# EAGLE design AudioMoth 1.1.0 (EAGLE 9.0.0)
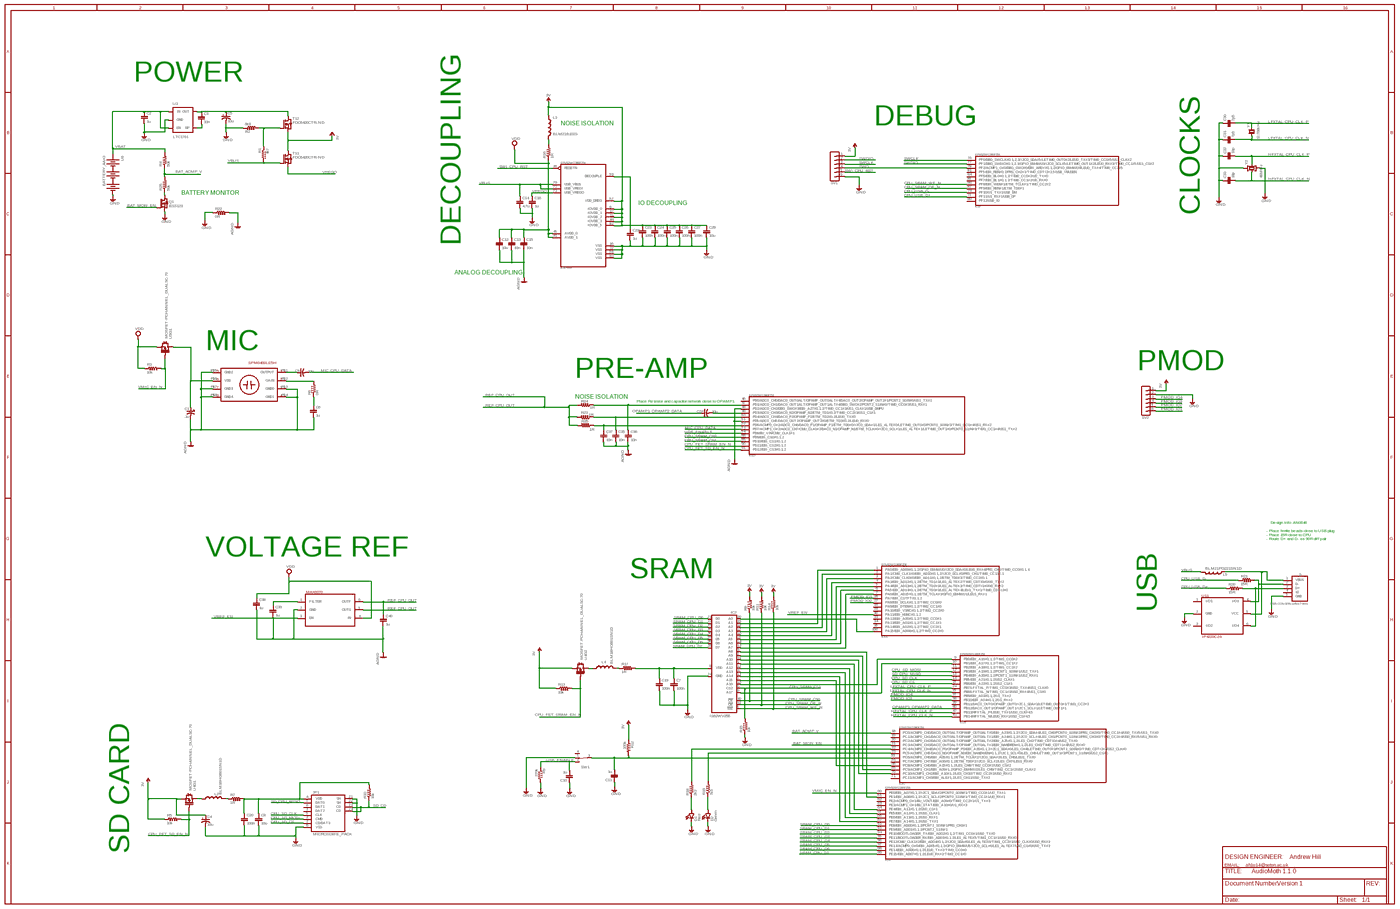
[diagram p0: schematic, sheet 1, overview]
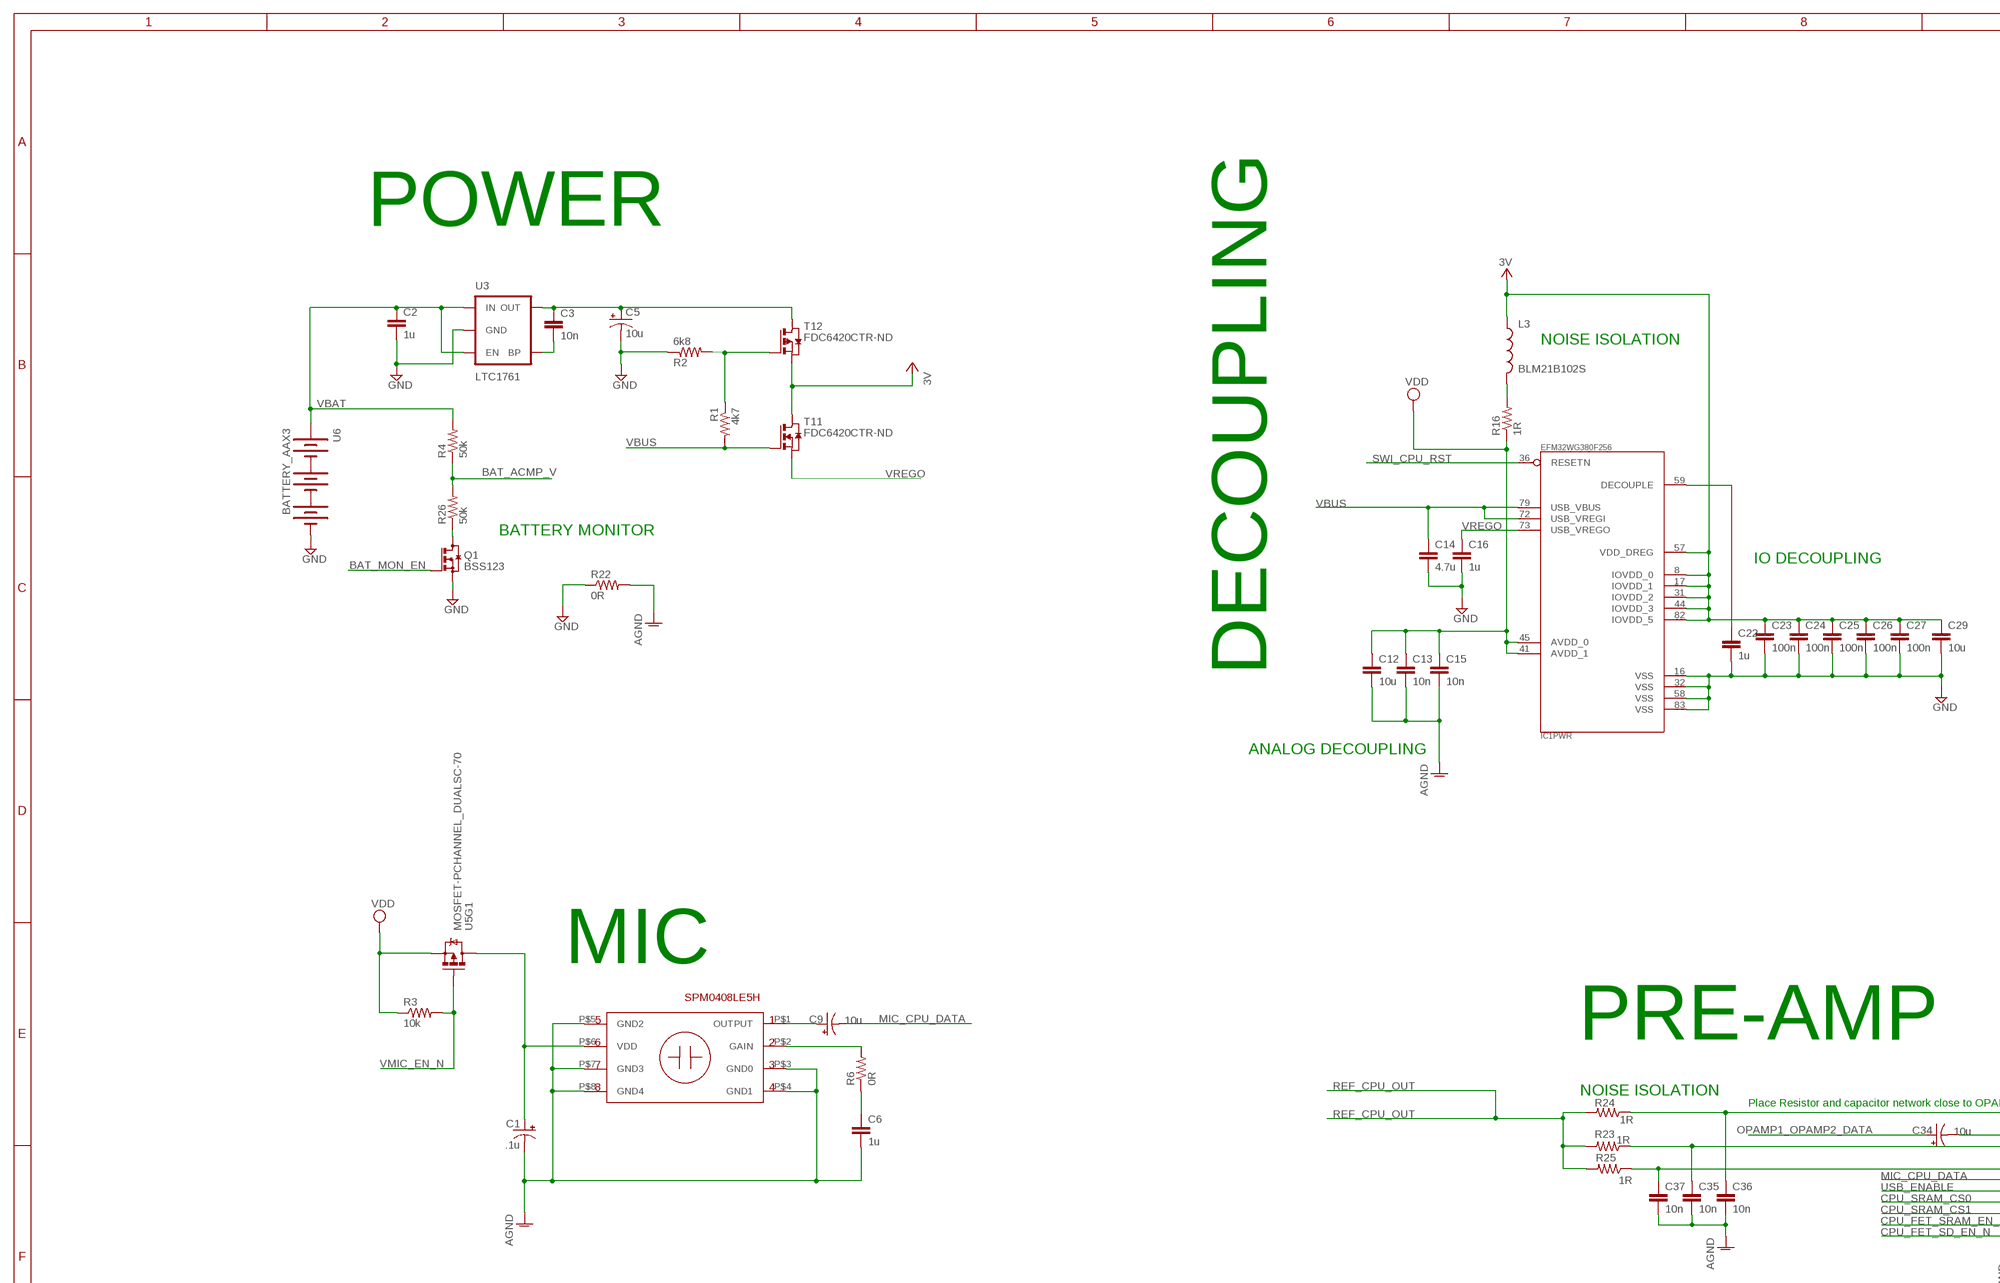
[diagram p1: schematic, sheet 1, part 1 of 4]
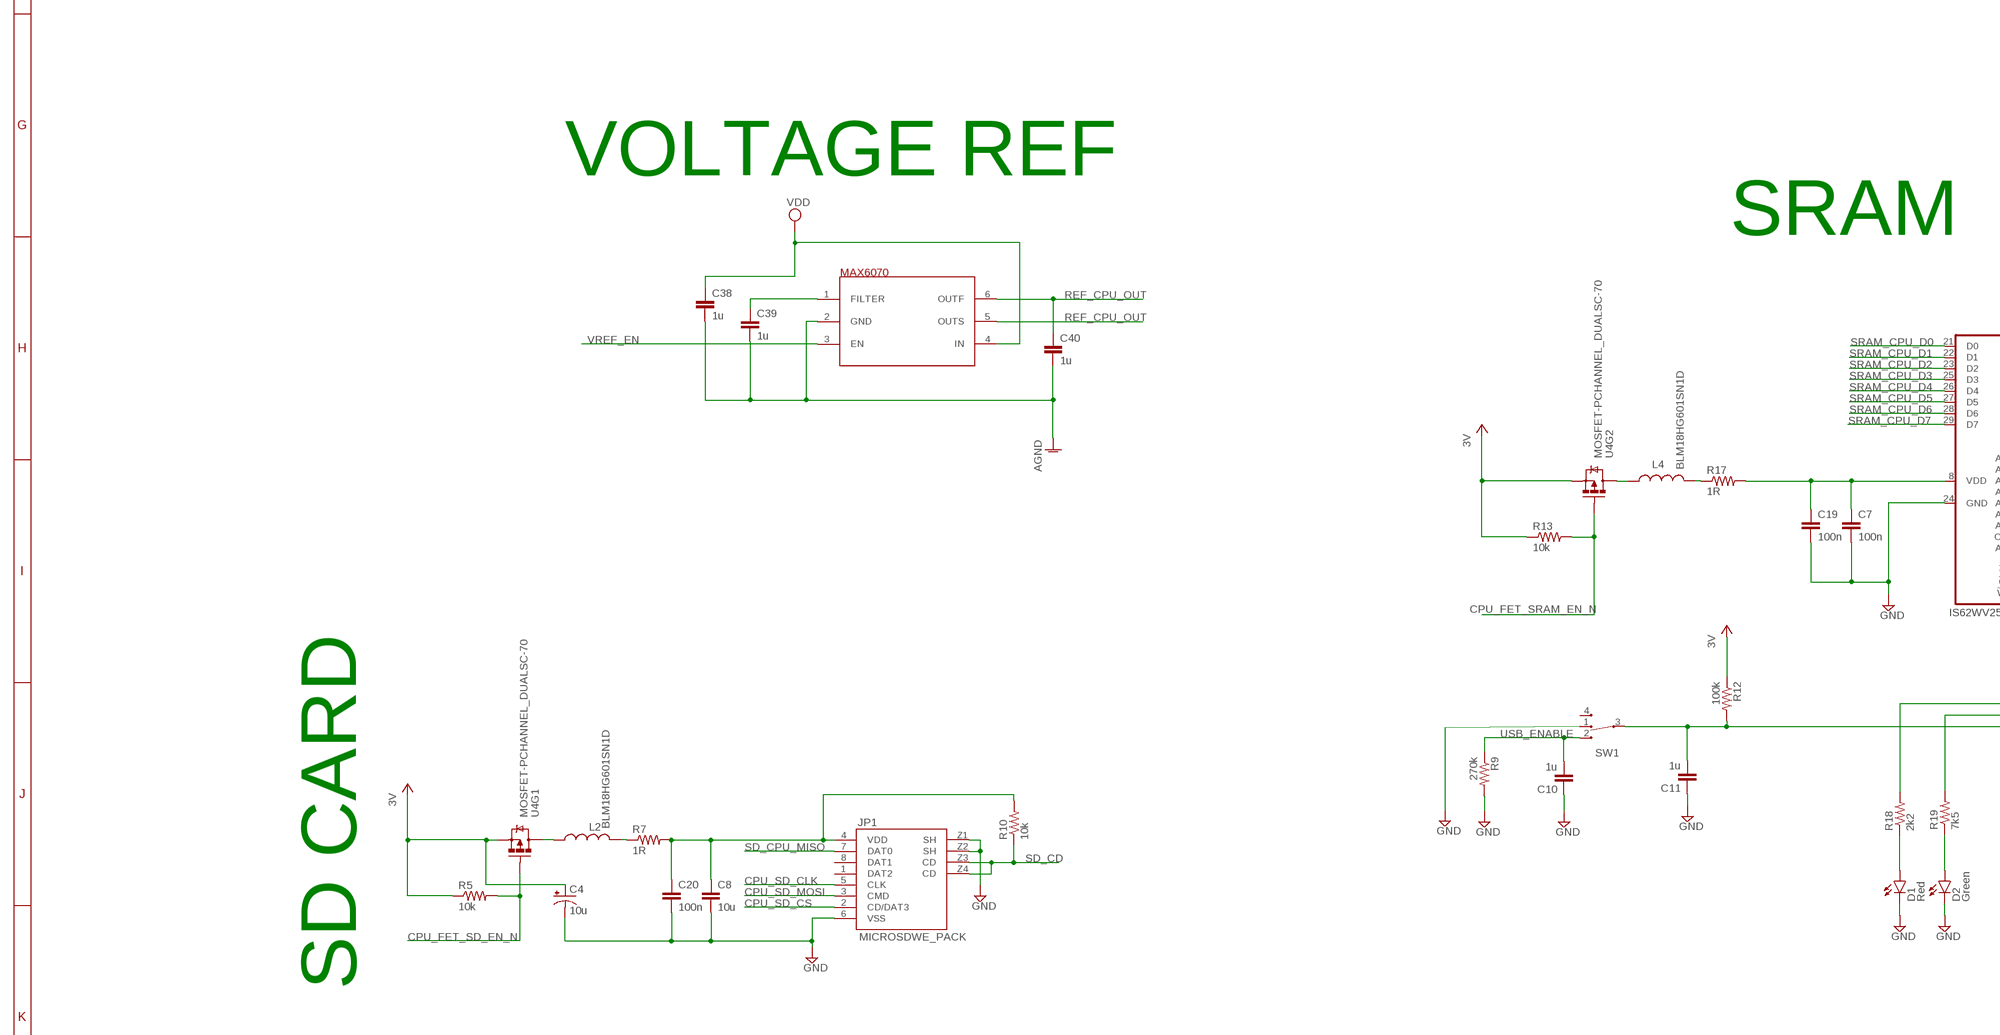
[diagram p2: schematic, sheet 1, part 2 of 4]
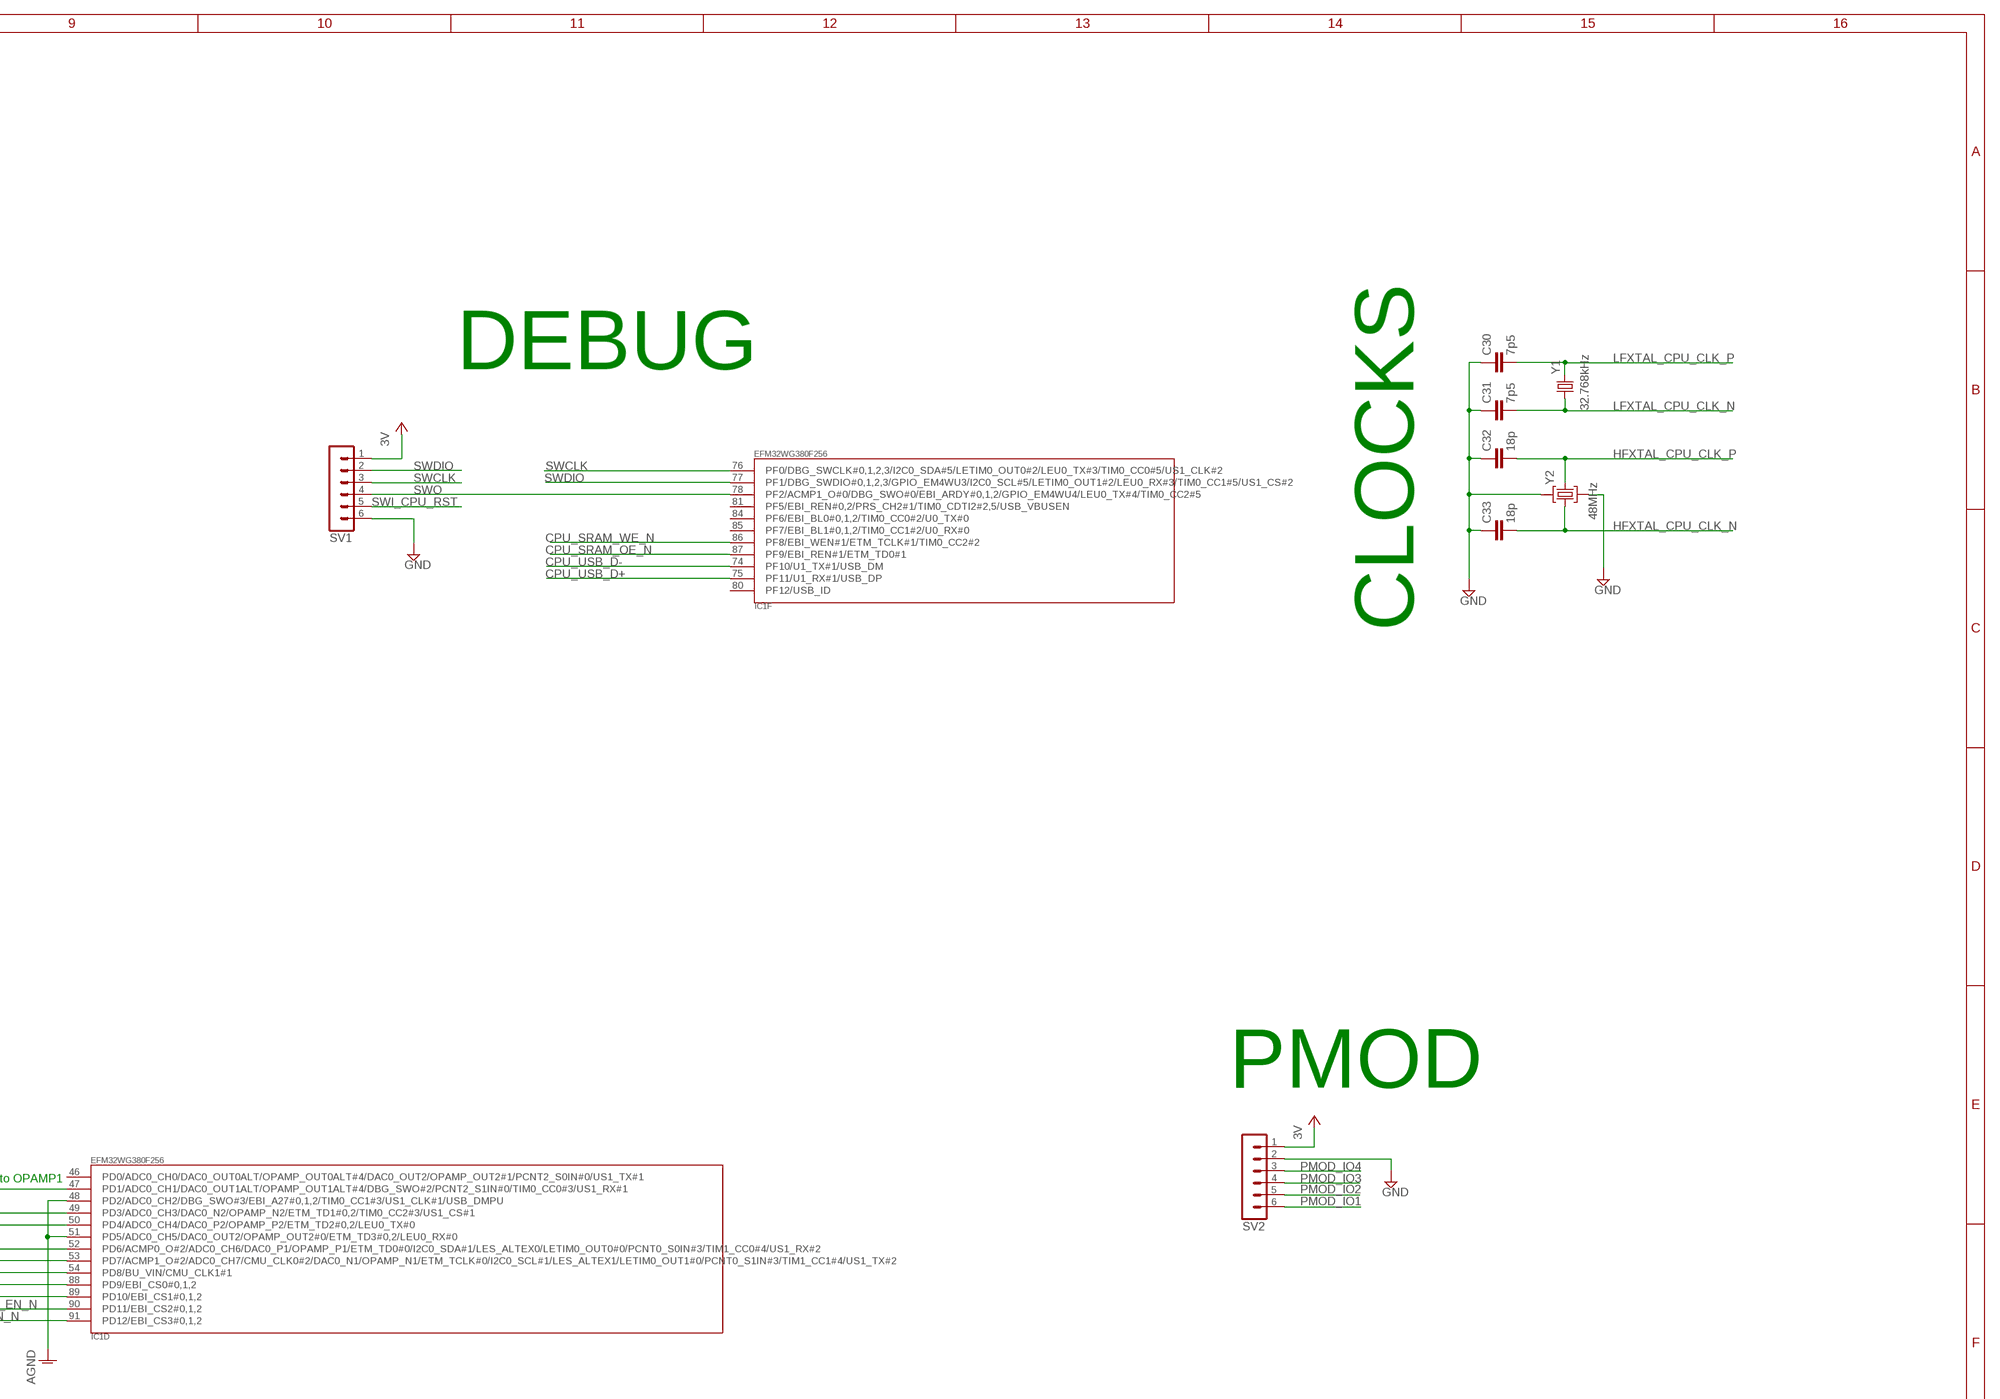
[diagram p3: schematic, sheet 1, part 3 of 4]
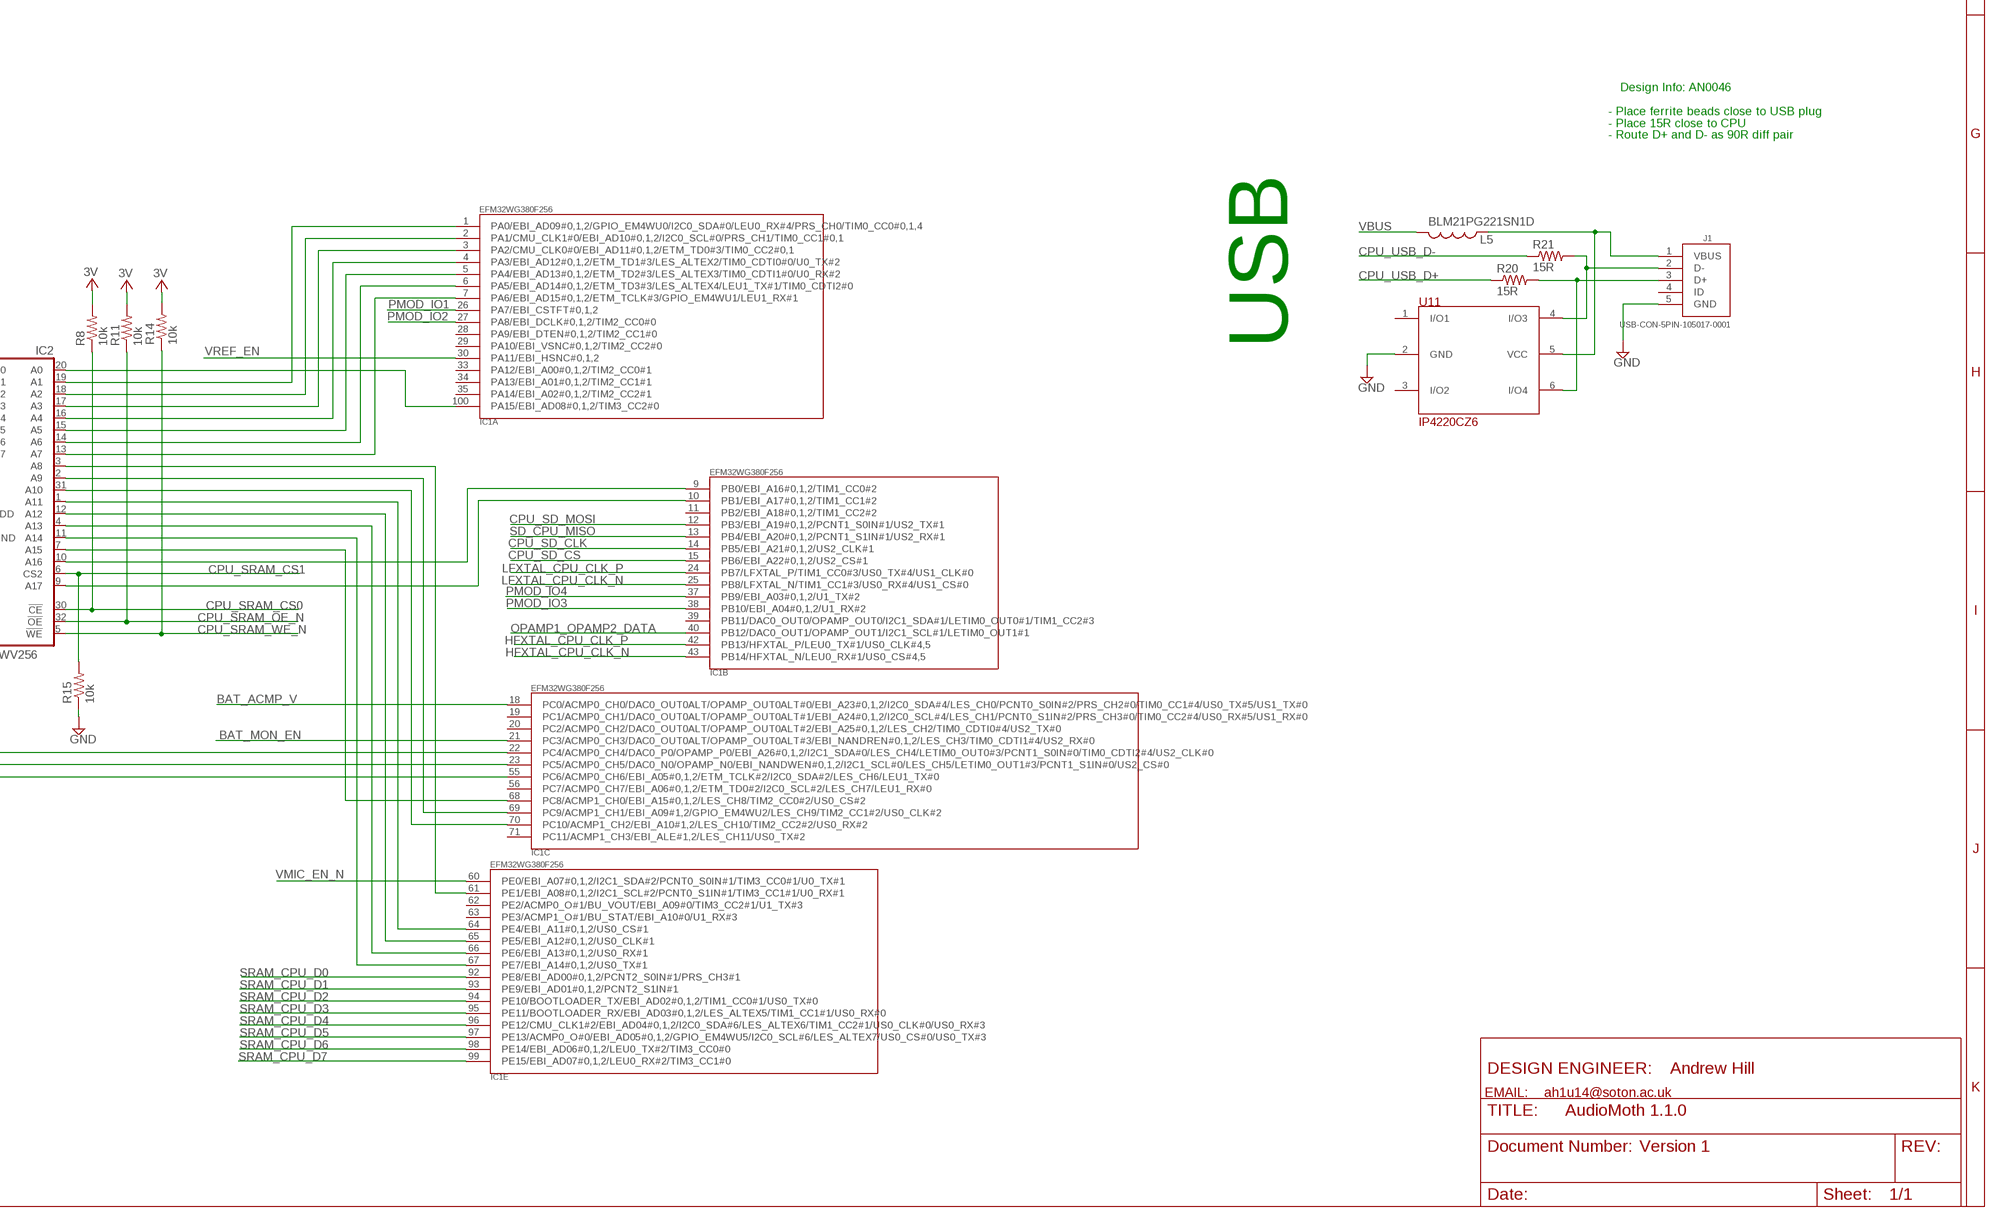
[diagram p4: schematic, sheet 1, part 4 of 4]

## Parts
C1  .1u  CAP_POL1206-KIT  [EIA3216-KIT]
C2  1u  CAP_0402  [0402]
C3  10n  CAP_0402  [0402]
C4  10u  CAP_POL1206-KIT  [EIA3216-KIT]
C5  10u  CAP_POL1206-KIT  [EIA3216-KIT]
C6  1u  CAP_0402  [0402]
C7  100n  CAP_0402  [0402]
C8  10u  C-EUC0603  [C0603]
C9  10u  CAP_POL1206-KIT  [EIA3216-KIT]
C10  1u  CAP_0402  [0402]
C11  1u  CAP_0402  [0402]
C12  10u  CAP0603-CAP  [0603-CAP]
C13  10n  CAP_0402  [0402]
C14  4.7u  CAP_0402  [0402]
C15  10n  CAP_0402  [0402]
C16  1u  CAP_0402  [0402]
C19  100n  CAP_0402  [0402]
C20  100n  CAP_0402  [0402]
C22  1u  CAP_0402  [0402]
C23  100n  CAP_0402  [0402]
C24  100n  CAP_0402  [0402]
C25  100n  CAP_0402  [0402]
C26  100n  CAP_0402  [0402]
C27  100n  CAP_0402  [0402]
C29  10u  C-EUC0603  [C0603]
C30  7p5  CAP_0402  [0402]
C31  7p5  CAP_0402  [0402]
C32  18p  CAP_0402  [0402]
C33  18p  CAP_0402  [0402]
C34  10u  CAP_POL1206-KIT  [EIA3216-KIT]
C35  10n  CAP_0402  [0402]
C36  10n  CAP_0402  [0402]
C37  10n  CAP_0402  [0402]
C38  1u  CAP_0402  [0402]
C39  1u  CAP_0402  [0402]
C40  1u  CAP_0402  [0402]
D1  Red  LED0603  [LED-0603]
D2  Green  LED0603  [LED-0603]
IC1  EFM32WG380F256  [QFP100]
IC2  IS62WV256  [IS62WV256]
J1  USB-CON-5PIN-105017-0001  [USB-MICRO-MOLEX-105017-0001]
JP1  MICROSDWE_PACK  [693071010811]
L2  BLM18HG601SN1D  INDUCTOR0603  [0603-RES]
L3  BLM21B102S  INDUCTOR0805  [0805]
L4  BLM18HG601SN1D  INDUCTOR0603  [0603-RES]
L5  BLM21PG221SN1D  INDUCTOR0603  [0603-RES]
Q1  BSS123  [SOT23]
R1  4k7  RES_0402  [0402]
R2  6k8  RES_0402  [0402]
R3  10k  RES_0402  [0402]
R4  50k  RES_0402  [0402]
R5  10k  RES_0402  [0402]
R6  0R  RES_0402  [0402]
R7  1R  RES_0402  [0402]
R8  10k  RES_0402  [0402]
R9  270k  RES_0402  [0402]
R10  10k  RES_0402  [0402]
R11  10k  RES_0402  [0402]
R12  100k  RES_0402  [0402]
R13  10k  RES_0402  [0402]
R14  10k  RES_0402  [0402]
R15  10k  RES_0402  [0402]
R16  1R  RES_0402  [0402]
R17  1R  RES_0402  [0402]
R18  2k2  RES_0402  [0402]
R19  7k5  RES_0402  [0402]
R20  15R  RES_0402  [0402]
R21  15R  RES_0402  [0402]
R22  0R  RESISTOR0603-RES  [0603-RES]
R23  1R  RES_0402  [0402]
R24  1R  RES_0402  [0402]
R25  1R  RES_0402  [0402]
R26  50k  RES_0402  [0402]
SV1  MA06-1SMD_BOARD_EDGE  [TSM-106-X-SH-BOARDEDGE]
SV2  MA06-1SMD_BOARD_EDGE  [TSM-106-X-SH-BOARDEDGE]
SW1  CT10-XXXX-CSS131  [CT10-XXXX-G4]
T1  FDC6420CTR-ND  PN_MOSFET-  [SOT23-6]
U1  MAX6070SOT23  [SOT26@1]
U2  SPM0408LE5H  [SPM0408LE5H-TB]
U3  LTC1761  [SOT23-5]
U4  MOSFET-PCHANNEL_DUALSC-70  [SC-70]
U5  MOSFET-PCHANNEL_DUALSC-70  [SC-70]
U6  BATTERY_AAX3  [BATTERY-AAX3]
U11  IP4220CZ6  [SC-74]
Y1  32.768kHz  CRYSTALEPSONMC146  [CRYSTAL-32KHZ-SMD_EPSON_MC146]
Y2  48MHz  XRCGB48M000F4M00R0  [XRCGB48M000F4M00R0]

## Nets
+3V3: C4.A(+) C23.1 C24.1 C25.1 C26.1 C27.1 C29.1 IC1.8(PWR:IOVDD_0) IC1.17(PWR:IOVDD_1) IC1.31(PWR:IOVDD_2) IC1.44(PWR:IOVDD_3) IC1.57(PWR:VDD_DREG) IC1.82(PWR:IOVDD_5) L3.1 R5.1 R8.2 R11.2 R12.1 R13.1 R14.2 SV1.1 SV2.1 T1.2(2:S) T1.6(1:D) U4.1(S) U4.4(S) ; supply symbol labelled 3V
AGND: C1.C(-) C6.2 C12.2 C13.2 C15.2 C35.2 C36.2 C37.2 C38.2 C39.2 C40.2 IC1.48(D:PD2/ADC0_CH2/DBG_SWO#3/EBI_A27#0,1,2/TIM0_CC1#3/US1_CLK#1/USB_DMPU) IC1.51(D:PD5/ADC0_CH5/DAC0_OUT2/OPAMP_OUT2#0/ETM_TD3#0,2/LEU0_RX#0) R22.2 U1.2(GND) U2.P$3(GND0) U2.P$4(GND1) U2.P$5(GND2) U2.P$7(GND3) U2.P$8(GND4)
BAT_ACMP_V: IC1.18(C:PC0/ACMP0_CH0/DAC0_OUT0ALT/OPAMP_OUT0ALT#0/EBI_A23#0,1,2/I2C0_SDA#4/LES_CH0/PCNT0_S0IN#2/PRS_CH2#0/TIM0_CC1#4/US0_TX#5/US1_TX#0) R4.1 R26.2
BAT_MON_EN: IC1.21(C:PC3/ACMP0_CH3/DAC0_OUT0ALT/OPAMP_OUT0ALT#3/EBI_NANDREN#0,1,2/LES_CH3/TIM0_CDTI1#4/US2_RX#0) Q1.1(G)
CPU_FET_SD_EN_N: IC1.91(D:PD12/EBI_CS3#0,1,2) R5.2 U4.2(G)
CPU_FET_SRAM_EN_N: IC1.90(D:PD11/EBI_CS2#0,1,2) R13.2 U4.5(G)
CPU_SD_CLK: IC1.14(B:PB5/EBI_A21#0,1,2/US2_CLK#1) JP1.5(CLK)
CPU_SD_CS: IC1.15(B:PB6/EBI_A22#0,1,2/US2_CS#1) JP1.2(CD/DAT3)
CPU_SD_MOSI: IC1.12(B:PB3/EBI_A19#0,1,2/PCNT1_S0IN#1/US2_TX#1) JP1.3(CMD)
CPU_SRAM_CS0: IC1.88(D:PD9/EBI_CS0#0,1,2) IC2.30(!CE) R8.1
CPU_SRAM_CS1: IC1.89(D:PD10/EBI_CS1#0,1,2) IC2.6(CS2) R15.2
CPU_SRAM_OE_N: IC1.87(F:PF9/EBI_REN#1/ETM_TD0#1) IC2.32(!OE) R11.1
CPU_SRAM_WE_N: IC1.86(F:PF8/EBI_WEN#1/ETM_TCLK#1/TIM0_CC2#2) IC2.5(!WE) R14.1
CPU_USB_D+: IC1.75(F:PF11/U1_RX#1/USB_DP) R20.1
CPU_USB_D-: IC1.74(F:PF10/U1_TX#1/USB_DM) R21.1
GND: C2.2 C4.C(-) C5.C(-) C7.2 C8.2 C10.1 C11.1 C14.2 C16.2 C19.2 C20.2 C22.2 C23.2 C24.2 C25.2 C26.2 C27.2 C29.2 C30.1 C31.1 C32.1 C33.1 D1.C D2.C IC1.16(PWR:VSS) IC1.32(PWR:VSS) IC1.58(PWR:VSS) IC1.83(PWR:VSS) IC2.24(GND) J1.5(GND) JP1.6(VSS) JP1.Z1(SH) JP1.Z2(SH) Q1.2(S) R2.1 R9.2 R15.1 R22.1 SV1.6 SV2.2 SW1.1 U3.2(GND) U6.GND@2(-) U11.2(GND) Y2.P$2 Y2.P$4
HFXTAL_CPU_CLK_N: C33.2 IC1.43(B:PB14/HFXTAL_N/LEU0_RX#1/US0_CS#4,5) Y2.P$3
HFXTAL_CPU_CLK_P: C32.2 IC1.42(B:PB13/HFXTAL_P/LEU0_TX#1/US0_CLK#4,5) Y2.P$1
LFXTAL_CPU_CLK_N: C31.2 IC1.25(B:PB8/LFXTAL_N/TIM1_CC1#3/US0_RX#4/US1_CS#0) Y1.P$2
LFXTAL_CPU_CLK_P: C30.2 IC1.24(B:PB7/LFXTAL_P/TIM1_CC0#3/US0_TX#4/US1_CLK#0) Y1.P$1
MIC_CPU_DATA: C9.C(-) IC1.53(D:PD7/ACMP1_O#2/ADC0_CH7/CMU_CLK0#2/DAC0_N1/OPAMP_N1/ETM_TCLK#0/I2C0_SCL#1/LES_ALTEX1/LETIM0_OUT1#0/PCNT0_S1IN#3/TIM1_CC1#4/US1_TX#2)
N$2: L3.2 R16.2
N$3: C22.1 IC1.59(PWR:DECOUPLE)
N$4: C8.1 C20.1 JP1.4(VDD) R7.2 R10.2
N$5: C34.C(-) IC1.49(D:PD3/ADC0_CH3/DAC0_N2/OPAMP_N2/ETM_TD1#0,2/TIM0_CC2#3/US1_CS#1)
N$6: L2.2 R7.1
N$7: L2.1 U4.6(D)
N$8: C9.A(+) U2.P$1(OUTPUT)
N$9: Q1.3(D) R26.1
N$11: C11.2 IC1.55(C:PC6/ACMP0_CH6/EBI_A05#0,1,2/ETM_TCLK#2/I2C0_SDA#2/LES_CH6/LEU1_TX#0) R12.2 SW1.3
N$13: C3.1 C5.A(+) T1.4(2:D) U3.5(OUT)
N$14: D2.A R19.1
N$15: D1.A R18.1
N$16: IC1.23(C:PC5/ACMP0_CH5/DAC0_N0/OPAMP_N0/EBI_NANDWEN#0,1,2/I2C1_SCL#0/LES_CH5/LETIM0_OUT1#3/PCNT1_S1IN#0/US2_CS#0) R19.2
N$17: IC1.22(C:PC4/ACMP0_CH4/DAC0_P0/OPAMP_P0/EBI_A26#0,1,2/I2C1_SDA#0/LES_CH4/LETIM0_OUT0#3/PCNT1_S0IN#0/TIM0_CDTI2#4/US2_CLK#0) R18.2
N$19: J1.1(VBUS) L5.1 U11.5(VCC)
N$23: C3.2 U3.4(BP)
N$28: IC1.100(A:PA15/EBI_AD08#0,1,2/TIM3_CC2#0) IC2.20(A0)
N$30: IC1.1(A:PA0/EBI_AD09#0,1,2/GPIO_EM4WU0/I2C0_SDA#0/LEU0_RX#4/PRS_CH0/TIM0_CC0#0,1,4) IC2.19(A1)
N$31: J1.2(D-) R21.2 U11.4(I/O3)
N$32: IC1.2(A:PA1/CMU_CLK1#0/EBI_AD10#0,1,2/I2C0_SCL#0/PRS_CH1/TIM0_CC1#0,1) IC2.18(A2)
N$33: IC1.3(A:PA2/CMU_CLK0#0/EBI_AD11#0,1,2/ETM_TD0#3/TIM0_CC2#0,1) IC2.17(A3)
N$34: J1.3(D+) R20.2 U11.6(I/O4)
N$35: R6.2 U2.P$2(GAIN)
N$36: C6.1 R6.1
N$37: IC1.4(A:PA3/EBI_AD12#0,1,2/ETM_TD1#3/LES_ALTEX2/TIM0_CDTI0#0/U0_TX#2) IC2.16(A4)
N$38: IC1.5(A:PA4/EBI_AD13#0,1,2/ETM_TD2#3/LES_ALTEX3/TIM0_CDTI1#0/U0_RX#2) IC2.15(A5)
N$39: IC1.6(A:PA5/EBI_AD14#0,1,2/ETM_TD3#3/LES_ALTEX4/LEU1_TX#1/TIM0_CDTI2#0) IC2.14(A6)
N$40: IC1.7(A:PA6/EBI_AD15#0,1,2/ETM_TCLK#3/GPIO_EM4WU1/LEU1_RX#1) IC2.13(A7)
N$41: IC1.61(E:PE1/EBI_A08#0,1,2/I2C1_SCL#2/PCNT0_S1IN#1/TIM3_CC1#1/U0_RX#1) IC2.3(A8)
N$42: IC1.69(C:PC9/ACMP1_CH1/EBI_A09#1,2/GPIO_EM4WU2/LES_CH9/TIM2_CC1#2/US0_CLK#2) IC2.2(A9)
N$43: IC1.70(C:PC10/ACMP1_CH2/EBI_A10#1,2/LES_CH10/TIM2_CC2#2/US0_RX#2) IC2.31(A10)
N$44: L4.1 U4.3(D)
N$45: IC1.64(E:PE4/EBI_A11#0,1,2/US0_CS#1) IC2.1(A11)
N$46: IC1.65(E:PE5/EBI_A12#0,1,2/US0_CLK#1) IC2.12(A12)
N$47: IC1.66(E:PE6/EBI_A13#0,1,2/US0_RX#1) IC2.4(A13)
N$48: IC1.67(E:PE7/EBI_A14#0,1,2/US0_TX#1) IC2.11(A14)
N$49: IC1.68(C:PC8/ACMP1_CH0/EBI_A15#0,1,2/LES_CH8/TIM2_CC0#2/US0_CS#2) IC2.7(A15)
N$50: IC1.9(B:PB0/EBI_A16#0,1,2/TIM1_CC0#2) IC2.10(A16)
N$52: IC1.10(B:PB1/EBI_A17#0,1,2/TIM1_CC1#2) IC2.9(A17)
N$53: C35.1 IC1.50(D:PD4/ADC0_CH4/DAC0_P2/OPAMP_P2/ETM_TD2#0,2/LEU0_TX#0) R23.1
N$54: C7.1 C19.1 IC2.8(VDD) R17.2
N$55: C36.1 IC1.47(D:PD1/ADC0_CH1/DAC0_OUT1ALT/OPAMP_OUT1ALT#4/DBG_SWO#2/PCNT2_S1IN#0/TIM0_CC0#3/US1_RX#1) R24.1
N$56: L4.2 R17.1
N$57: C37.1 IC1.52(D:PD6/ACMP0_O#2/ADC0_CH6/DAC0_P1/OPAMP_P1/ETM_TD0#0/I2C0_SDA#1/LES_ALTEX0/LETIM0_OUT0#0/PCNT0_S0IN#3/TIM1_CC0#4/US1_RX#2) R25.1
N$59: C39.1 U1.1(FILTER)
N$62: R1.1 R2.2 T1.3(2:G)
OPAMP1_OPAMP2_DATA: C34.A(+) IC1.40(B:PB12/DAC0_OUT1/OPAMP_OUT1/I2C1_SCL#1/LETIM0_OUT1#1)
PMOD_IO1: IC1.26(A:PA7/EBI_CSTFT#0,1,2) SV2.6
PMOD_IO2: IC1.27(A:PA8/EBI_DCLK#0,1,2/TIM2_CC0#0) SV2.5
PMOD_IO3: IC1.38(B:PB10/EBI_A04#0,1,2/U1_RX#2) SV2.4
PMOD_IO4: IC1.37(B:PB9/EBI_A03#0,1,2/U1_TX#2) SV2.3
REF_CPU_OUT: C40.1 R23.2 R24.2 R25.2 U1.5(OUTS) U1.6(OUTF)
SD_CD: JP1.Z3(CD) JP1.Z4(CD) R10.1
SD_CPU_MISO: IC1.13(B:PB4/EBI_A20#0,1,2/PCNT1_S1IN#1/US2_RX#1) JP1.7(DAT0)
SRAM_CPU_D0: IC1.92(E:PE8/EBI_AD00#0,1,2/PCNT2_S0IN#1/PRS_CH3#1) IC2.21(D0)
SRAM_CPU_D1: IC1.93(E:PE9/EBI_AD01#0,1,2/PCNT2_S1IN#1) IC2.22(D1)
SRAM_CPU_D2: IC1.94(E:PE10/BOOTLOADER_TX/EBI_AD02#0,1,2/TIM1_CC0#1/US0_TX#0) IC2.23(D2)
SRAM_CPU_D3: IC1.95(E:PE11/BOOTLOADER_RX/EBI_AD03#0,1,2/LES_ALTEX5/TIM1_CC1#1/US0_RX#0) IC2.25(D3)
SRAM_CPU_D4: IC1.96(E:PE12/CMU_CLK1#2/EBI_AD04#0,1,2/I2C0_SDA#6/LES_ALTEX6/TIM1_CC2#1/US0_CLK#0/US0_RX#3) IC2.26(D4)
SRAM_CPU_D5: IC1.97(E:PE13/ACMP0_O#0/EBI_AD05#0,1,2/GPIO_EM4WU5/I2C0_SCL#6/LES_ALTEX7/US0_CS#0/US0_TX#3) IC2.27(D5)
SRAM_CPU_D6: IC1.98(E:PE14/EBI_AD06#0,1,2/LEU0_TX#2/TIM3_CC0#0) IC2.28(D6)
SRAM_CPU_D7: IC1.99(E:PE15/EBI_AD07#0,1,2/LEU0_RX#2/TIM3_CC1#0) IC2.29(D7)
SWCLK: IC1.76(F:PF0/DBG_SWCLK#0,1,2,3/I2C0_SDA#5/LETIM0_OUT0#2/LEU0_TX#3/TIM0_CC0#5/US1_CLK#2) SV1.3
SWDIO: IC1.77(F:PF1/DBG_SWDIO#0,1,2,3/GPIO_EM4WU3/I2C0_SCL#5/LETIM0_OUT1#2/LEU0_RX#3/TIM0_CC1#5/US1_CS#2) SV1.2
SWI_CPU_RST: IC1.36(PWR:RESETN) SV1.5
SWO: IC1.78(F:PF2/ACMP1_O#0/DBG_SWO#0/EBI_ARDY#0,1,2/GPIO_EM4WU4/LEU0_TX#4/TIM0_CC2#5) SV1.4
USB_ENABLE: C10.2 IC1.54(D:PD8/BU_VIN/CMU_CLK1#1) R9.1 SW1.2
VAMP: C1.A(+) U2.P$6(VDD) U5.6(D)
VBAT: C2.1 R4.2 U3.1(IN) U3.3(EN) U6.PWR@1(+)
VBUS: C14.1 IC1.72(PWR:USB_VREGI) IC1.79(PWR:USB_VBUS) L5.2 R1.2 T1.1(1:G)
VDD: C12.1 C13.1 C15.1 C38.1 IC1.41(PWR:AVDD_1) IC1.45(PWR:AVDD_0) R3.1 R16.1 U1.4(IN) U5.1(S)
VMIC_EN_N: IC1.60(E:PE0/EBI_A07#0,1,2/I2C1_SDA#2/PCNT0_S0IN#1/TIM3_CC0#1/U0_TX#1) R3.2 U5.2(G)
VREF_EN: IC1.30(A:PA11/EBI_HSNC#0,1,2) U1.3(EN)
VREGO: C16.1 IC1.73(PWR:USB_VREGO) T1.5(1:S)
Unconnected: IC1.11(B:PB2/EBI_A18#0,1,2/TIM1_CC2#2) IC1.19(C:PC1/ACMP0_CH1/DAC0_OUT0ALT/OPAMP_OUT0ALT#1/EBI_A24#0,1,2/I2C0_SCL#4/LES_CH1/PCNT0_S1IN#2/PRS_CH3#0/TIM0_CC2#4/US0_RX#5/US1_RX#0) IC1.20(C:PC2/ACMP0_CH2/DAC0_OUT0ALT/OPAMP_OUT0ALT#2/EBI_A25#0,1,2/LES_CH2/TIM0_CDTI0#4/US2_TX#0) IC1.28(A:PA9/EBI_DTEN#0,1,2/TIM2_CC1#0) IC1.29(A:PA10/EBI_VSNC#0,1,2/TIM2_CC2#0) IC1.33(A:PA12/EBI_A00#0,1,2/TIM2_CC0#1) IC1.34(A:PA13/EBI_A01#0,1,2/TIM2_CC1#1) IC1.35(A:PA14/EBI_A02#0,1,2/TIM2_CC2#1) IC1.39(B:PB11/DAC0_OUT0/OPAMP_OUT0/I2C1_SDA#1/LETIM0_OUT0#1/TIM1_CC2#3) IC1.46(D:PD0/ADC0_CH0/DAC0_OUT0ALT/OPAMP_OUT0ALT#4/DAC0_OUT2/OPAMP_OUT2#1/PCNT2_S0IN#0/US1_TX#1) IC1.56(C:PC7/ACMP0_CH7/EBI_A06#0,1,2/ETM_TD0#2/I2C0_SCL#2/LES_CH7/LEU1_RX#0) IC1.62(E:PE2/ACMP0_O#1/BU_VOUT/EBI_A09#0/TIM3_CC2#1/U1_TX#3) IC1.63(E:PE3/ACMP1_O#1/BU_STAT/EBI_A10#0/U1_RX#3) IC1.71(C:PC11/ACMP1_CH3/EBI_ALE#1,2/LES_CH11/US0_TX#2) IC1.80(F:PF12/USB_ID) IC1.81(F:PF5/EBI_REN#0,2/PRS_CH2#1/TIM0_CDTI2#2,5/USB_VBUSEN) IC1.84(F:PF6/EBI_BL0#0,1,2/TIM0_CC0#2/U0_TX#0) IC1.85(F:PF7/EBI_BL1#0,1,2/TIM0_CC1#2/U0_RX#0) J1.4(ID) JP1.1(DAT2) JP1.8(DAT1) SW1.4 U5.3(D) U5.4(S) U5.5(G) U11.1(I/O1) U11.3(I/O2)

## Notes on the sheet
- POWER
- NOISE ISOLATION | DEBUG
- BATTERY MONITOR
- IO DECOUPLING
- CLOCKS
- DECOUPLING
- ANALOG DECOUPLING
- MIC
- SPM0408LE5H
- PRE-AMP | PMOD
- NOISE ISOLATION
- Place Resistor and capacitor network close to OPAMP1
- Design Info: AN0046
- - Place ferrite beads close to USB plug
- - Place 15R close to CPU
- - Route D+ and D- as 90R diff pair
- VOLTAGE REF
- SRAM
- USB
- IS62WV256
- SD CARD
- DESIGN ENGINEER:    Andrew Hill
- EMAIL:    ah1u14@soton.ac.uk
- Version 1

## Library data of the parts
C1 = SparkFun-Passives:CAP_POL: Capacitor Polarized These are standard SMD and PTH capacitors. Normally 10uF, 47uF, and 100uF in electrolytic and tantalum varieties. Always verify the external diameter of the through hole cap, it varies with capacity, voltage, and manufacturer. The EIA devices should be standard.; MF: VISHAY SPRAGUE; MPN: 293D106X96R3A2TE3; OC_FARNELL: 1754143
C2 C3 C6 C7 C10 C11 C13-C16 C19 C20 C22-C27 C30-C33 = Perfect_0402:CAP_0402: 0402 (1005 Metric) Nick Garner - TeleSense
C4 C5 C9 C34 = SparkFun-Passives:CAP_POL: Capacitor Polarized These are standard SMD and PTH capacitors. Normally 10uF, 47uF, and 100uF in electrolytic and tantalum varieties. Always verify the external diameter of the through hole cap, it varies with capacity, voltage, and manufacturer. The EIA devices should be standard.; MF: AVX; MPN: 0603ZD106MAT2A; OC_FARNELL: 1867954
C8 C29 = rcl:C-EU: CAPACITOR, European symbol; MF: AVX; MPN: 0603ZD106MAT2A; OC_FARNELL: 1867954
C12 = SparkFun-Capacitors:CAP: Capacitor Standard 0603 ceramic capacitor, and 0.1" leaded capacitor.; MF: AVX; MPN: 0603ZD106MAT2A; OC_FARNELL: 1867954
C35-C37 = Perfect_0402:CAP_0402: 0402 (1005 Metric) Nick Garner - TeleSense; MF: WALSIN; MPN: 0603B103K250CT; OC_FARNELL: 2496827
C38-C40 = Perfect_0402:CAP_0402: 0402 (1005 Metric) Nick Garner - TeleSense; MF: MULTICOMP; MPN: MC0603F105Z100CT; OC_FARNELL: 1759398
D1 D2 = SparkFun-LED:LED: LEDs Standard schematic elements and footprints for 5mm, 3mm, 1206, and 0603 sized LEDs. 5mm - Spark Fun Electronics SKU : COM-00529 (and others)
IC1 = EFM32:EFM32WG380F256: EFM32WG380F256 Wonder Microcontroller in 14mm x 14mm QFP100 package
IC2 = acousticLib:IS62WV256
J1 = GeekAmmo:USB-CON-5PIN: Molex Micro USB 105017-0001
JP1 = acousticLib:MICROSD; MF: WURTH ELEKTRONIK; MPN: 693071010811; OC_FARNELL: 2081363
L2 L4 L5 = acousticLib:INDUCTOR: Inductors; OC_FARNELL: unknown
L3 = SparkFun-Passives:INDUCTOR: Inductors
Q1 = transistor-small-signal:BSS123: N-CHANNEL MOS FET
R1-R21 R26 = Perfect_0402:RES_0402: 0402 (1005 Metric) Nick Garner - TeleSense
R22 = SparkFun-Passives:RESISTOR: Resistor Basic schematic elements and footprints for 0603, 1206, and PTH resistors.
R23-R25 = Perfect_0402:RES_0402: 0402 (1005 Metric) Nick Garner - TeleSense; MF: MULTICOMP; MPN: MC0063W0603510K; OC_FARNELL: 9331700
SV1 SV2 = acousticLib:MA06-1: PIN HEADER; OC_FARNELL: unknown
SW1 = switch-coto:CT10-XXXX-: CT10 Series Molded Switch Source: www.cotorelay.com .. Coto_Technology__CT10-1530-G1.pdf
T1 = zetex:PN_MOSFET-: DUAL N AND P-CHANNEL ENHANCEMENT MODE MOSFET Source: Data sheet <http://www.farnell.com/datasheets/1693880.pdf>
U1 = acousticLib:MAX6070
U2 = acousticLib:SPM0408LE5H
U3 = acousticLib:LTC1761; MF: LINEAR TECHNOLOGY; MPN: LT1761ES5-3.3#TRMPBF; OC_FARNELL: 1663779
U4 U5 = acousticLib:MOSFET-PCHANNEL_DUAL
U6 = acousticLib:BATTERY_AAX3
U11 = acousticLib:IP4220CZ6: IP4220CZ6 The IP4220CZ6 is designed to protect I/O lines sensitive to capacitive load, such as USB 2.0 http://www.farnell.com/datasheets/1708221.pdf
Y1 = acousticLib:CRYSTAL: Various standard crystals. Proven footprints.; MF: AEL CRYSTALS; MPN: X32K768S019; OC_FARNELL: 2467443
Y2 = acousticLib:XRCGB48M000F4M00R0: XRCGB48M000F4M00R0 48MHz Clock; MF: ABRACON; MPN: ABM3B-12.000MHZ-B2-T; OC_FARNELL: 1611810

## Net classes
0 default: width 0.152 mm, drill 0.305 mm, clearance 0.152 mm

## Board
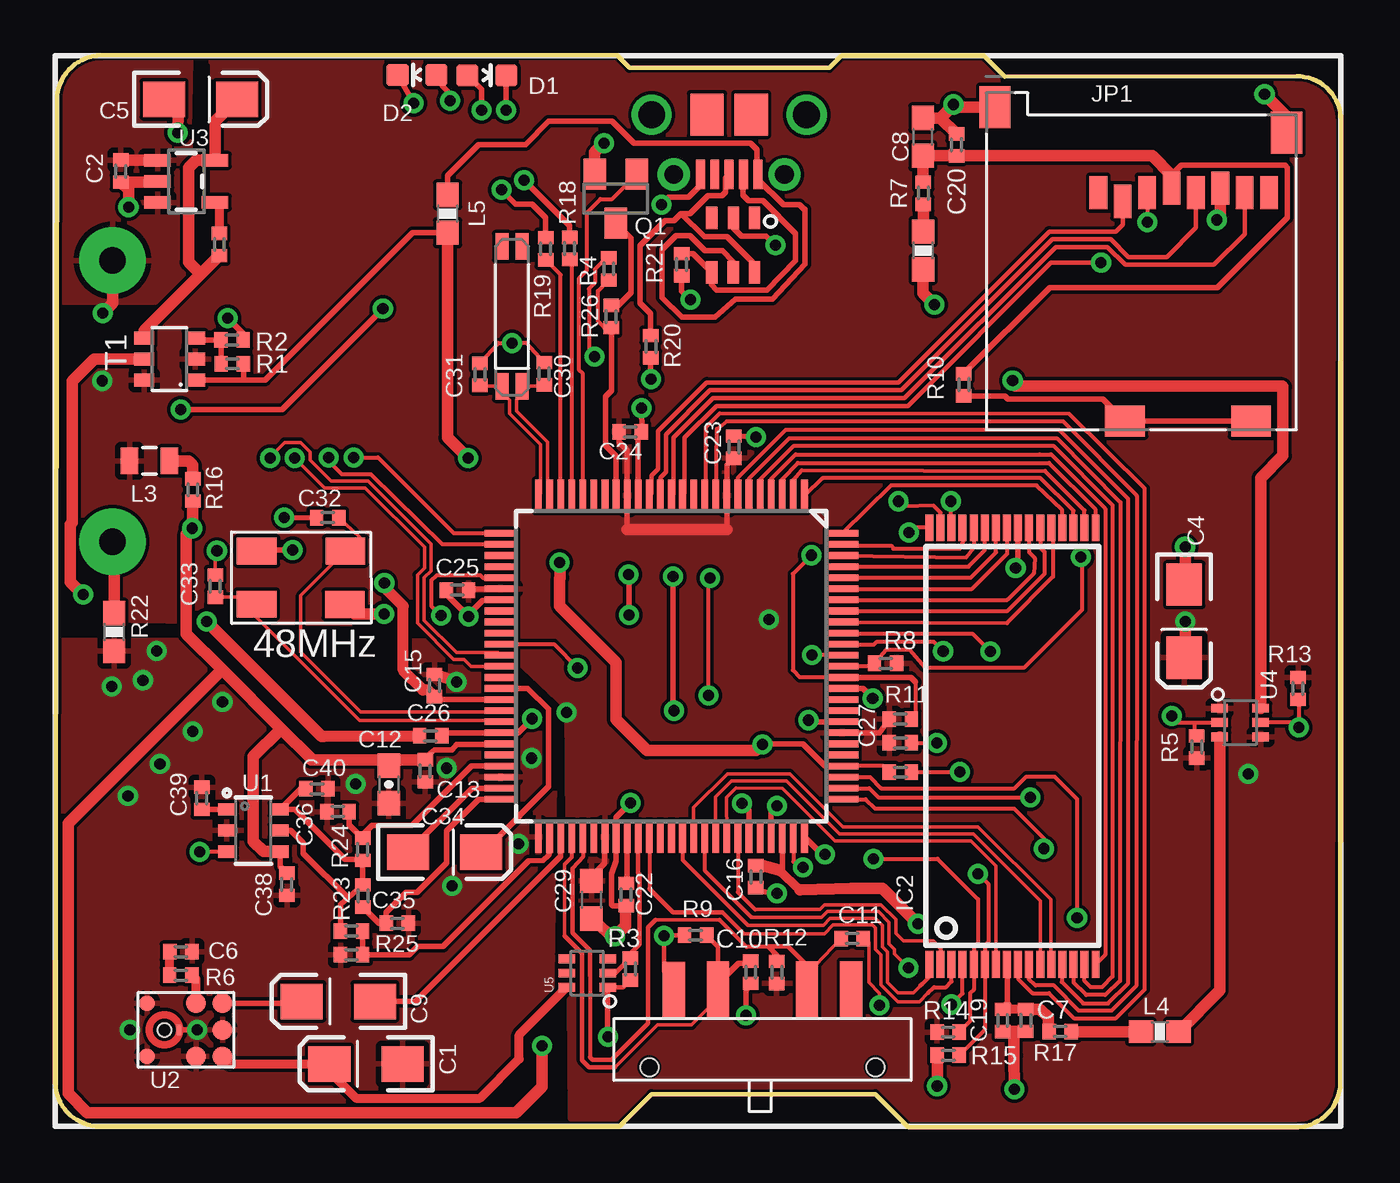
[diagram p5: board, top side]
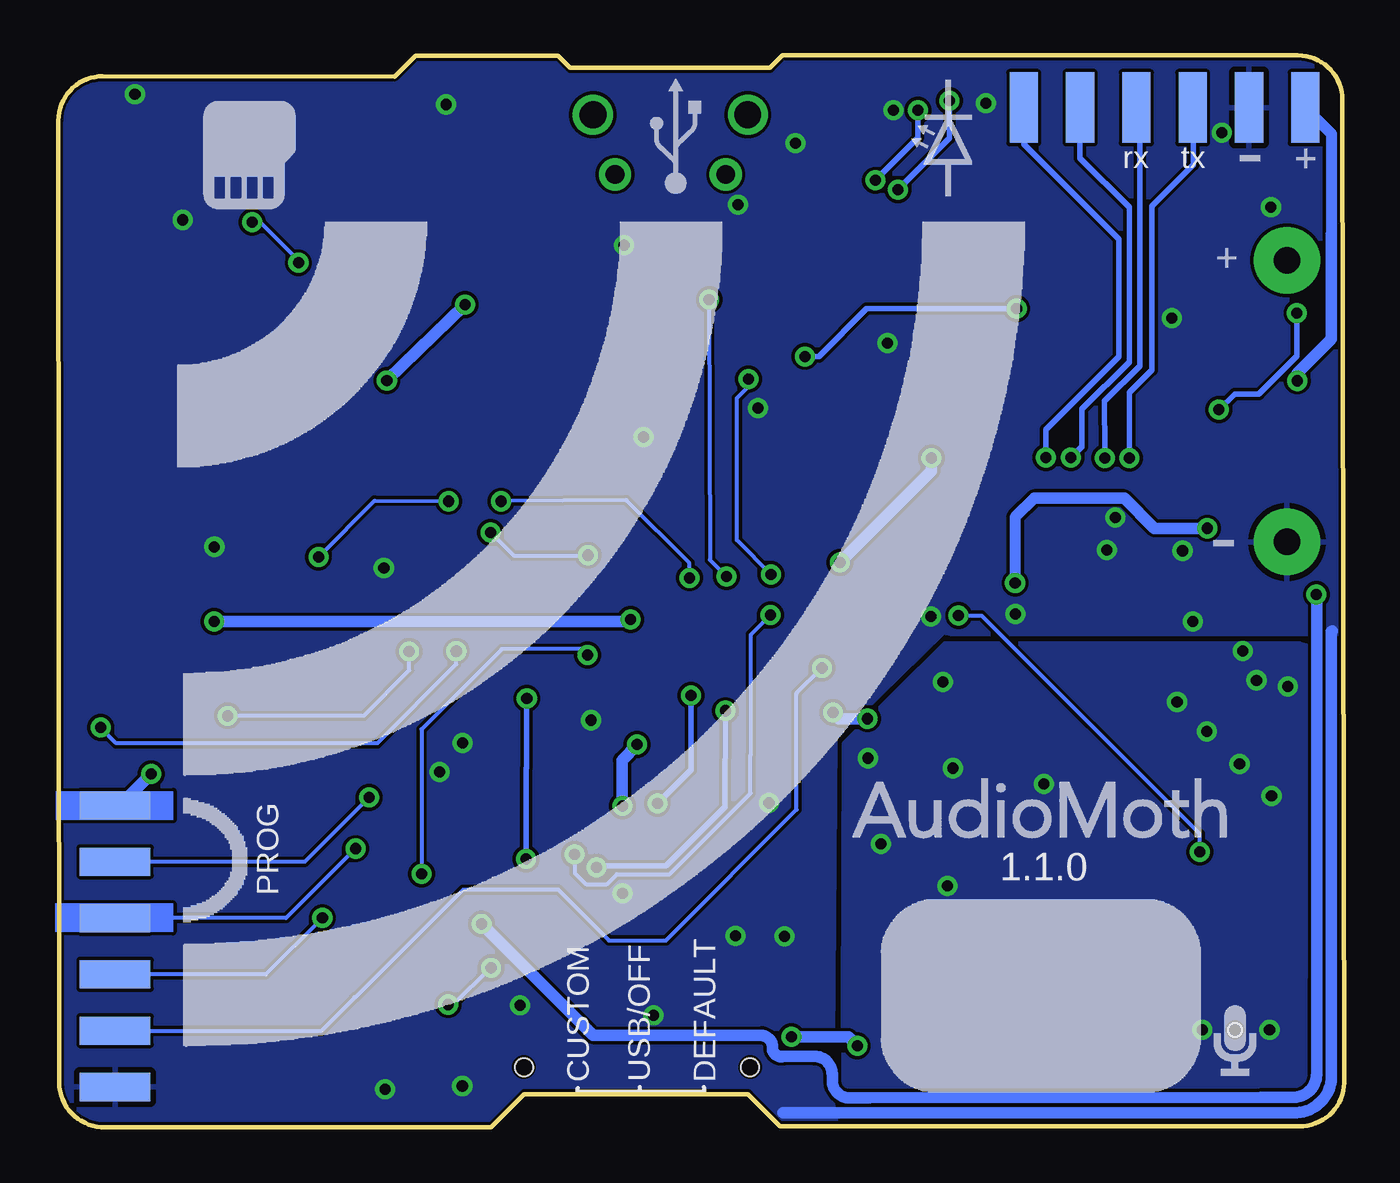
[diagram p6: board, bottom side, seen from below]

Size 58 x 48.36 mm. Coordinates in mm from the lower left corner, seen from the top.
Outline: 26.89,1.5 36.99,1.5 38.49,0 55.89,0 arc90 57.97,2 58,45.42 arc90 56,47.42 42.84,47.4 41.89,48.35 35.47,48.35 34.92,47.8 25.9,47.8 25.34,48.36 2.08,48.36 arc90 0.08,46.36 0,2 arc90 2.02,0.05 25.44,0.05 26.89,1.5
Copper layers (1*16): Top 0.035mm / dielectric 1.5mm / Bottom 0.035mm
Design rules "default *": minimum track width 5mil, minimum drill 0.019mm, track to track 6mil, track to pad 5mil, pad to pad 5mil, via to via 5mil, smd to smd 5mil, copper to edge 5mil, drill to drill 3mil, minimum pad ring 10mil, minimum via ring 8mil, stop-mask expansion 0mil, vias tented up to drill 20mil, thermal gap 10mil

### Footprints (pad centres in the part's own frame; a part is rotated, then mirrored left to right if it is on the bottom)
EIA3216-KIT = smd 1.9 x 1.6: A 1.65,0; C -1.65,0
0402 = smd 0.6 x 0.7: 1 -0.5,0; 2 0.5,0
C0603 = smd 1.1 x 1: 1 -0.85,0; 2 0.85,0
0603-CAP = smd 1.1 x 1: 1 -0.85,0; 2 0.85,0
LED-0603 = smd 1 x 1: A 0,-0.877; C 0,0.877
QFP100 = smd 1.45 x 0.3: 1 -7.7,6; 2 -7.7,5.5; 3 -7.7,5; 4 -7.7,4.5; 5 -7.7,4; 6 -7.7,3.5; 7 -7.7,3; 8 -7.7,2.5; 9 -7.7,2; 10 -7.7,1.5; 11 -7.7,1; 12 -7.7,0.5; 13 -7.7,0; 14 -7.7,-0.5; 15 -7.7,-1; 16 -7.7,-1.5; 17 -7.7,-2; 18 -7.7,-2.5; 19 -7.7,-3; 20 -7.7,-3.5; 21 -7.7,-4; 22 -7.7,-4.5; 23 -7.7,-5; 24 -7.7,-5.5; 25 -7.7,-6; 51 7.7,-6; 52 7.7,-5.5; 53 7.7,-5; 54 7.7,-4.5; 55 7.7,-4; 56 7.7,-3.5; 57 7.7,-3; 58 7.7,-2.5; 59 7.7,-2; 60 7.7,-1.5; 61 7.7,-1; 62 7.7,-0.5; 63 7.7,0; 64 7.7,0.5; 65 7.7,1; 66 7.7,1.5; 67 7.7,2; 68 7.7,2.5; 69 7.7,3; 70 7.7,3.5; 71 7.7,4; 72 7.7,4.5; 73 7.7,5; 74 7.7,5.5; 75 7.7,6 | smd 0.3 x 1.45: 26 -6,-7.7; 27 -5.5,-7.7; 28 -5,-7.7; 29 -4.5,-7.7; 30 -4,-7.7; 31 -3.5,-7.7; 32 -3,-7.7; 33 -2.5,-7.7; 34 -2,-7.7; 35 -1.5,-7.7; 36 -1,-7.7; 37 -0.5,-7.7; 38 0,-7.7; 39 0.5,-7.7; 40 1,-7.7; 41 1.5,-7.7; 42 2,-7.7; 43 2.5,-7.7; 44 3,-7.7; 45 3.5,-7.7; 46 4,-7.7; 47 4.5,-7.7; 48 5,-7.7; 49 5.5,-7.7; 50 6,-7.7; 76 6,7.7; 77 5.5,7.7; 78 5,7.7; 79 4.5,7.7; 80 4,7.7; 81 3.5,7.7; 82 3,7.7; 83 2.5,7.7; 84 2,7.7; 85 1.5,7.7; 86 1,7.7; 87 0.5,7.7; 88 0,7.7; 89 -0.5,7.7; 90 -1,7.7; 91 -1.5,7.7; 92 -2,7.7; 93 -2.5,7.7; 94 -3,7.7; 95 -3.5,7.7; 96 -4,7.7; 97 -4.5,7.7; 98 -5,7.7; 99 -5.5,7.7; 100 -6,7.7
IS62WV256 = smd 0.36 x 1.2: 1 -3.75,-9.85; 2 -3.25,-9.85; 3 -2.75,-9.85; 4 -2.25,-9.85; 5 -1.75,-9.85; 6 -1.25,-9.85; 7 -0.75,-9.85; 8 -0.25,-9.85; 9 0.25,-9.85; 10 0.75,-9.85; 11 1.25,-9.85; 12 1.75,-9.85; 13 2.25,-9.85; 14 2.75,-9.85; 15 3.25,-9.85; 16 3.75,-9.85; 17 3.75,9.85; 18 3.25,9.85; 19 2.75,9.85; 20 2.25,9.85; 21 1.75,9.85; 22 1.25,9.85; 23 0.75,9.85; 24 0.25,9.85; 25 -0.25,9.85; 26 -0.75,9.85; 27 -1.25,9.85; 28 -1.75,9.85; 29 -2.25,9.85; 30 -2.75,9.85; 31 -3.25,9.85; 32 -3.75,9.85
USB-MICRO-MOLEX-105017-0001 = smd 0.4 x 1.35: 1 1.2,0; 2 1.85,0; 3 2.5,0; 4 3.15,0; 5 3.8,0 | drill 0.85 pad 1.45: P$1 0,0; P$2 5,0 | smd 1.5 x 1.9: P$3 3.5,-2.7; P$4 1.5,-2.7 | drill 1.2: P$5 -1.006,-2.685; P$6 5.997,-2.697; P$7 -0.983,-2.697
693071010811 = smd 0.8 x 1.5: 1 0,0; 2 1.1,-0.4; 3 2.2,0; 4 3.3,0.2; 5 4.4,0; 6 5.5,0.2; 7 6.6,0; 8 7.7,0 | smd 1.4 x 1.9: Z1 -4.66,3.85; Z2 8.49,2.7 | smd 1.8 x 1.4: Z3 1.2,-10.3; Z4 6.89,-10.3
0603-RES = smd 1.1 x 1: 1 -0.85,0; 2 0.85,0
0805 = smd 0.8 x 1.2: 1 -0.9,0; 2 0.9,0
SOT23 = smd 1 x 1.4: 1 -0.95,-1.1; 2 0.95,-1.1; 3 0,1.1
TSM-106-X-SH-BOARDEDGE = smd 1.27 x 3.175: 1 -6.35,-1.473; 2 -3.81,-1.473; 3 -1.27,-1.473; 4 1.27,-1.473; 5 3.81,-1.473; 6 6.35,-1.473
CT10-XXXX-G4 = smd 1 x 2.5: 1 0,1.01; 2 2,1.025; 3 6,1.025; 4 8,1.025 | hole 0.8: -1.1,-2.5; 9.1,-2.5
SOT23-6 = smd 0.6 x 0.9: 1 -0.95,-1.15; 2 0,-1.15; 3 0.95,-1.15; 4 0.95,1.15; 5 0,1.15; 6 -0.95,1.15
SOT26@1 = smd 0.55 x 0.8: 1 -0.95,-1.2; 2 0,-1.2; 3 0.95,-1.2; 4 0.95,1.2; 5 0,1.2; 6 -0.95,1.2
SPM0408LE5H-TB = smd 0.9 x 0.9: P$1 -1.2,1.7; P$2 -1.2,0.506; P$5 1.208,0.506; P$6 1.208,1.7; P$7 0.004,1.7 | smd 0.7 x 0.7: P$3 -1.2,-1.706; P$4 1.208,-1.706 | smd 0.406 x 0.203: P$8 0,-0.26 | hole 0.6: 0.004,-0.916
SOT23-5 = smd 0.55 x 1.2: 1 -0.95,-1.3; 2 0,-1.3; 3 0.95,-1.3; 4 0.95,1.3; 5 -0.95,1.3
SC-70 = smd 0.4 x 0.75: 1 -0.65,-0.925; 2 0,-0.925; 3 0.65,-0.925; 4 0.65,0.925; 5 0,0.925; 6 -0.65,0.925
BATTERY-AAX3 = drill 1.2 pad 3: GND@2 -26.42,2.22; PWR@1 -26.42,14.92
SC-74 = smd 0.508 x 1.016: 1 -0.727,-1.248; 2 0.225,-1.25; 3 1.2,-1.25; 4 1.205,1.2; 5 0.235,1.195; 6 -0.725,1.2
CRYSTAL-32KHZ-SMD_EPSON_MC146 = smd 1.2 x 0.6: NC1 6.9,1.2; NC2 6.9,0.3; P$1 0.6,0.3; P$2 0.6,1.2
XRCGB48M000F4M00R0 = smd 1.8 x 1.2: P$1 -1.963,-1.306; P$2 2.035,-1.308; P$3 2.038,1.093; P$4 -1.943,1.107

### Placement (x,y rotation side)
C1  14.01,2.86 180 top
C2  2.95,43.14 270 top
C3  7.39,39.83 90 top
C4  50.92,22.84 270 top
C5  6.55,46.38 0 top
C6  5.66,7.92 0 top
C7  43.78,4.83 270 top
C8  39.13,44.69 90 top
C9  12.77,5.68 180 top
C10  31.36,6.99 90 top
C11  35.95,8.51 180 top
C12  15.04,15.47 270 top
C13  16.68,16.08 270 top
C14  38.12,16.03 0 top
C15  17.1,19.93 90 top
C16  31.6,11.31 270 top
C19  42.74,4.82 270 top
C20  40.65,44.32 90 top
C22  25.75,10.51 270 top
C23  30.6,30.69 90 top
C24  25.93,31.38 0 top
C25  18.14,24.24 180 top
C26  16.93,17.66 180 top
C27  38.12,17.34 0 top
C29  24.18,10.27 270 top
C30  22.06,34 270 top
C31  19.15,33.97 270 top
C32  12.28,27.51 0 top
C33  7.21,24.42 270 top
C34  17.56,12.41 0 top
C35  15.43,9.21 0 top
C36  12.75,14.24 180 top
C37  13.36,7.78 180 top
C38  10.44,10.96 270 top
C39  6.6,14.84 90 top
C40  11.8,15.27 0 top
D1  19.46,47.47 270 top
D2  16.32,47.47 90 top
IC1  27.79,20.8 270 top
IC2  43.18,17.2 0 top
J1  32.9,42.99 180 top
JP1  47.05,42.17 0 top
L2  39.15,39.56 90 top
L3  4.24,30.07 0 top
L4  49.82,4.32 180 top
L5  17.69,41.21 270 top
Q1  25.28,41.89 180 top
R1  7.98,34.45 0 top
R2  7.97,35.52 180 top
R3  25.94,7.14 90 top
R4  24.96,38.72 90 top
R5  51.49,17.16 90 top
R6  5.66,6.86 0 top
R7  39.15,42.14 90 top
R8  37.45,20.93 0 top
R9  28.88,8.67 180 top
R10  40.97,33.5 90 top
R11  38.12,18.41 180 top
R12  32.54,6.99 90 top
R13  56.06,19.8 270 top
R14  40.28,4.29 180 top
R15  40.28,3.25 0 top
R16  6.2,28.75 90 top
R17  45.33,4.32 180 top
R18  23.2,39.65 270 top
R19  22.12,39.64 270 top
R20  26.86,35.22 90 top
R21  28.25,38.92 90 top
R22  2.65,22.34 270 top
R23  13.87,10.43 90 top
R24  13.86,12.54 270 top
R25  13.36,8.85 180 top
R26  25.07,36.58 270 top
SV1  53.97,8.17 270 bottom
SV2  8.1,44.53 180 bottom
SW1  27.9,5.21 0 top
T1  5.15,34.66 90 top
U1  8.93,13.39 270 top
U2  5.84,4.4 270 top
U3  5.9,42.68 270 top
U4  53.45,18.26 270 top
U5  23.99,6.96 90 top
U6  29,24.19 0 top
U11  30.81,39.77 180 top
Y1  21.35,32.84 90 top
Y2  11.12,24.69 180 top

### Tracks (layer width: path | path; a pad name or v marks a point on that pad's centre or on a via)
+3V3  (via drill 0.5)
  Top 0.254: C25.1 18.7,24.3 IC1.31 18.73,24.3 18.69,24.26 | C24.1 25.43,30.92 25.8,30.56 IC1.17 25.79,26.98 25.8,26.98 | C23.1 30.29,29.88 IC1.8 30.29,26.98 | v21.51,18.43 20.87,17.8 IC1.44 17.57,17.8 C26.1 | R11.2 37.18,17.8 IC1.82 | IC1.57 24.78,13.09 24.78,11.91 24.17,11.3 C29.1
  Top 0.508: 50.9,21.16 C4.A 50.97,21.23 v50.97,22.83 | 30.29,26.98 25.8,26.98 | 18.69,24.26 18.61,24.33
  Bottom 0.5: SV2.1 0.57,44.82 0.57,40.3
  Bottom 0.508: v50.97,22.83 32.28,22.83 v32.2,22.91 | v23.07,18.71 22.79,18.43 v21.51,18.43 | SV1.1 55.23,14.52 v53.81,15.94 | 0.57,40.3 0.57,35.57 2.11,34.03 v2.11,33.68
  pour Top: 6.9,48.21 25.49,48.21 25.9,47.8 35.02,47.8 35.06,47.84 35.17,47.84 35.61,48.28 41.84,48.28 42.76,47.36 56.64,47.36 56.68,47.4 57.58,47.21 57.75,47.03 57.85,0.41 57.62,0.18 23.41,0.18 23.21,0.38 23.05,18.9 19.14,22.61 0.27,22.86 0.07,23.22 0.07,36.02 0.22,36.32 4.77,36.32 7.08,38.63 7.08,47.96 6.9,48.13
AGND  (via drill 0.5)
  Top 0.254: U2.P$8 v6.4,4.4
  Top 0.508: C15.2 17.11,20.44 v18.1,20.1 | v4.56,21.49 4.52,21.45
  other vias: 3.95,20.17 2.55,19.89 17.64,16.2 3.36,4.4 17.9,10.9 20.89,12.79 7.53,19.2 6.19,17.85 4.71,16.39 3.27,14.96 13.54,15.49 21.49,16.65
  pour Top: 0.04,0.15 0.22,21.98 18.38,21.95 22.55,17.77 22.55,17.71 22.55,17.7 22.42,8.3 22.41,5.81 22.31,0.3 19.8,0.16
  pour Bottom: 2.03,21.81 17.95,21.83 22.53,17.3 22.58,5.13 22.56,1.69 1.93,1.71 1.77,1.73 1.73,21.71
BAT_ACMP_V
  Top 0.178: R26.2 24.77,36.08 24.47,36.38 24.47,37.73 R4.1
  Top 0.254: IC1.18 25.29,30.27 24.81,30.76 24.81,32.96 25.1,33.25 25.1,36.05 R26.2 | R4.1 24.96,38.18
BAT_MON_EN
  Top 0.178: IC1.21 23.79,34 23.63,34.16 23.63,38.32 23.98,38.66 23.98,41.27 24.59,41.88 25.12,41.88 Q1.1
CPU_FET_SD_EN_N  (via drill 0.5)
  Top 0.178: IC1.91 35.51,22.28 41.37,22.28 v42.17,21.47 | v50.36,18.57 50.67,18.26 51.4,18.26 | 51.4,18.26 U4.2 | R5.2 51.4,17.74 51.4,18.26
  Bottom 0.178: v50.36,18.57 44.24,18.57 42.17,20.63 v42.17,21.47
CPU_FET_SRAM_EN_N  (via drill 0.5)
  Top 0.178: U4.5 55.88,18.26 v56.1,18.03 56.1,19.26 R13.2 | v40.05,21.48 39.61,21.92 37.07,21.92 36.93,21.77 35.52,21.77 IC1.90
  Bottom 0.178: v56.1,18.03 55.39,17.32 43.63,17.32 40.05,20.9 v40.05,21.48
CPU_SD_CLK
  Top 0.2: IC1.14 27.29,29.31 27.54,29.56 27.54,31.26 29.53,33.25 38.17,33.25 44.98,40.06 47.61,40.06 48.41,39.26 50.13,39.26 51.45,40.58 JP1.5 51.31,42.03
  Top 0.254: IC1.14 27.29,28.28
CPU_SD_CS
  Top 0.2: IC1.15 26.89,28.59 26.89,29.41 27.19,29.7 27.19,31.41 29.38,33.61 38.03,33.61 44.84,40.41 47.76,40.41 47.84,40.41 48.15,40.72 JP1.2
CPU_SD_MOSI  (via drill 0.5)
  Top 0.178: JP1.3 v49.26,40.83
  Top 0.2: IC1.12 28.39,28.59 28.39,31.12 29.82,32.55 30.11,32.55 37.06,32.54 | 37.06,32.54 | 37.06,32.54 38.46,32.54 44.92,39 v47.17,39
  Top 0.254: IC1.12 28.29,28.49
  Bottom 0.178: v47.17,39 47.15,39.08 48.9,40.83 v49.26,40.83
CPU_SRAM_CS0  (via drill 0.5)
  Top 0.178: 35.51,20.78 IC1.88 36.81,20.8 R8.1 37.48,21.55 38.52,21.55 39.22,20.75 43.72,20.75 46.32,23.36 46.32,25.68 v46.27,25.73 | IC2.30 40.4,27.08 v40.4,28.25 | 35.54,20.8 35.59,20.75
  Top 0.254: 35.51,20.78 35.54,20.8
  Bottom 0.178: v46.27,25.73 43.73,28.27 v40.4,28.25
CPU_SRAM_CS1  (via drill 0.5)
  Top 0.178: v41.62,11.43 42.08,10.97 42.08,8.36 41.93,8.21 IC2.6 41.93,4.4 R15.2 | IC1.89 35.48,21.31 v34.13,21.31
  Bottom 0.178: v41.62,11.43 41.62,17.96 37.99,21.59 34.41,21.59 v34.13,21.31
CPU_SRAM_OE_N  (via drill 0.5)
  Top 0.178: IC1.87 33.59,20.3 33.27,20.62 33.27,24.97 v34.1,25.81 | 38.8,20.09 38.8,18.42 R11.1 | IC2.32 38.71,27.05 v38.5,26.84
  Top 0.254: 38.8,20.09 38.6,20.3 IC1.87
  Bottom 0.178: v34.1,25.81 37.47,25.81 v38.5,26.84
CPU_SRAM_WE_N  (via drill 0.5)
  Top 0.178: IC2.5 | IC2.5 41.43,6.21 41.27,6.04 41.27,4.78 R14.1 | IC2.5 41.43,8.14 41.62,8.33 41.62,10.29 39.79,12.12 v36.9,12.12
  Top 0.254: IC1.86 36.43,19.8 v36.87,19.36
  Bottom 0.254: v36.87,19.36 36.87,16.2 36.9,16.18 v36.9,12.12
CPU_USB_D+  (via drill 0.5)
  Top 0.254: R20.1 v26.86,33.76 v26.87,33.76 | v34.71,12.32 34.71,12.18 IC1.75 | v25.85,24.94 25.87,24.92 v25.87,23.11
  Bottom 0.178: 26.87,33.58 26.87,33.43 27.4,32.89 27.4,26.49 v25.85,24.94 | v25.87,23.11 26.76,22.23 26.76,16.82 26.78,16.8 26.78,15.06 30.42,11.42 32.81,11.42 33.26,10.96 34.21,10.96 34.71,11.47 v34.71,12.32
  Bottom 0.254: v26.87,33.76 26.87,33.58
CPU_USB_D-  (via drill 0.5)
  Top 0.178: IC1.74 33.29,11.99 v33.72,11.73
  Top 0.254: v27.86,24.84 27.86,19.02 27.91,18.97 v27.91,18.8 | v28.64,37.34 28.25,37.73 R21.1
  Bottom 0.178: v28.64,37.34 28.62,25.6 v27.86,24.84
  Bottom 0.254: v27.91,18.8 27.93,14.45 30.6,11.79 33.52,11.79 v33.72,11.73
GND  (via drill 0.5, 0.5 pad 0.25)
  Top 0.152: C33.1 7.21,25.96 v7.29,26.01 | C11.1 36.7,8.34 36.7,6.53 37.18,6.05 v37.17,5.5
  Top 0.178: C31.1 19.98,35.38 v20.61,35.38 21.26,35.38 C30.1 | C27.2 v39.76,17.34 v39.76,17.35 | C14.2 39.89,16.03 v40.8,16.03
  Top 0.2: R9.2 27.48,8.67 v27.46,8.64 27.46,7.04 SW1.1
  Top 0.254: IC1.32 20.07,23.77 19.27,23.77 18.63,23.14 v18.63,23.04 17.64,24.03 C25.2 | C32.1 11.64,27.48 v10.33,27.52 | Y2.P$2 9.13,26.05 v10.71,26.05 | IC1.16 26.28,31.23 C24.2 26.47,31.42 v26.45,32.44 | IC2.24 43.43,25.48 | C23.2 31.24,31.16 v31.6,31.15 | IC1.83 34.04,18.3 v33.97,18.37 | C16.2 31.84,10.65 v32.55,10.55 | C22.2 25.73,9.98 25.16,9.98 25.09,10.06 25.09,11.43 25.29,12.01 25.29,13.06 25.32,13.08 | IC1.58 25.29,13.98 v25.94,14.63 | v40.51,46.15 41.91,46.15 JP1.Z1 | D2.C 16,46.49 v16.16,46.21 | D1.C 20.34,46.12 v20.33,45.88 | U11.2 30.59,40.56 30.94,40.2 32.05,40.2 v32.49,39.79 | R2.1 8.47,35.8 v7.77,36.51 | v31.16,5.04 31.16,6.11 C10.1 | v27.34,41.63 27.67,41.96 28.55,41.96 29.1,42.51 J1.5
  Top 0.406: 43.43,25.48 v43.32,25.23
  Top 0.508: C8.2 39.94,45.54 | 39.94,45.54 C20.2 | JP1.Z1 40.42,46.02 39.94,45.54 | C19.2 43.25,4.33 | 43.25,4.33 C7.2 | v43.26,1.71 43.25,3.25 43.25,4.33 | C26.2 12.1,17.63 12.01,17.63 v6.82,22.83 | C29.2 25.08,8.61 v25.25,8.61 25.73,9.08 25.73,9.98 | 4.81,46.48 C5.C 5.53,45.77 v5.52,44.87 | 55.9,44.51 JP1.Z2 55.54,45.61 v54.55,46.61 | v52.4,40.94 52.55,41.09 JP1.6 | v14.84,23.16 13.49,23.16 Y2.P$4 | R15.1 v39.78,1.86 | Q1.2 24.33,43.99 v24.74,44.41 | C4.C 50.97,24.53 v50.97,26.19 | U3.2 4.57,42.64 C2.2 3.3,42.29 v3.3,41.52 | R22.1 2.65,26.34 U6.GND@2
  Bottom 0.508: 0.53,22.4 0.57,22.36 0.57,2.43 arc90 2.15,0.65 23.13,0.66 25.31,0.66
  pour Bottom: 1.05,48.31 25.46,48.31 26,47.77 34.82,47.77 34.85,47.8 35.02,47.8 35.57,48.35 41.9,48.35 42.93,47.32 56.64,47.32 56.86,47.29 57.74,47.04 57.81,0.18 22.9,0.25 23.11,1.13 22.97,17.56 18.08,22.34 17.71,22.27 0.09,22.26 0.3,47.66
HFXTAL_CPU_CLK_N
  Top 0.152: 9.19,23.49 Y2.P$3 | IC1.43 20.03,18.36 13.72,18.36 9.08,23.01 Y2.P$3 | 9.16,23.6 Y2.P$3 | C33.2 8.78,23.92 Y2.P$3
HFXTAL_CPU_CLK_P
  Top 0.152: IC1.42 19.89,18.75 13.77,18.75 11.07,21.45 11.07,23.99 Y2.P$1 13.72,26.64 C32.2
LFXTAL_CPU_CLK_N
  Top 0.152: C31.2 19.2,33.44 Y1.P$2 20.16,33.15 20.49,32.82 20.49,32.2 21.89,30.8 21.89,28.59 IC1.25
LFXTAL_CPU_CLK_P
  Top 0.152: C30.2 22.04,33.44 Y1.P$1 | IC1.24 22.29,28.79 22.19,28.89 22.19,30.92 20.79,32.32 20.79,32.82 21.05,33.08 Y1.P$1 | 20.95,33.34 Y1.P$1
MIC_CPU_DATA
  Top 0.254: IC1.53 22.79,12.22 16.25,5.68 C9.C
N$2
  Top 0.508: L3.2 6,30.07 6.2,29.87 R16.2
N$3
  Top 0.254: IC1.59 25.79,11.05 C22.1
N$4
  Top 0.254: R10.2 44.86,37.88 52.41,37.88 55.58,41.05 55.58,43.3 55.48,43.4 50.79,43.4 50.35,42.96
  Top 0.508: 40.64,43.84 C8.1 39.13,42.66 R7.2 | 40.64,43.84 C20.1 | 40.64,43.84 49.48,43.84 50.35,42.96 JP1.4
N$5
  Top 0.254: C34.C 18.79,15.3 IC1.49
N$6
  Top 0.508: R7.1 L2.2
N$7  (via drill 0.5)
  Top 0.508: L2.1 39.15,37.63 v39.66,37.12 | v43.19,33.69 43.31,33.44 55.35,33.44 55.38,33.41 55.38,30.3 54.38,29.3 U4.6
  Bottom 0.508: v39.66,37.12 v43.19,33.69
N$8
  Top 0.254: U2.P$1 11.03,5.6 C9.A
N$9
  Top 0.254: R26.1 25.38,37.08 25.96,37.66 25.96,40.11 Q1.3
N$11
  Top 0.152: 27.07,9.35 29.95,9.35 29.96,9.35 | 33.73,7.14 33.9,7.31 34.28,7.31 C11.2
  Top 0.178: IC1.55 23.79,12.2 23.33,11.69 | 24.11,6.84 24.11,3.17 | 29.96,9.35 31.19,8.14 32.16,8.14
  Top 0.2: 32.16,8.14 32.2,8.14 32.23,8.17 33.04,8.17 33.9,7.31 SW1.3 | 24.11,3.17 24.23,3.05 25.09,3.05 26.74,4.7 26.74,9.02 27.07,9.35 | 29.95,9.35 29.96,9.35 | 23.33,11.69 23.33,8.78 24.11,7.99 24.11,6.84
  Top 0.254: R12.2 32.54,7.79 32.2,8.14
N$13
  Top 0.508: C3.1 6.55,38.48 | 6.55,38.48 4,35.94 T1.4 | C5.A 7.2,45.38 U3.5 6.35,43.63 6.01,43.29 6.01,39.02 6.55,38.48
N$14  (via drill 0.5)
  Top 0.254: R19.1 22.12,41.04 21.5,41.66 20.77,41.66 v20.12,42.3 | D2.A 17.09,47.37 17.81,46.64 v17.81,46.31
  Bottom 0.254: v20.12,42.3 17.81,44.62 v17.81,46.31
N$15  (via drill 0.5)
  Top 0.254: R18.1 23.2,40.67 v21.15,42.72 | D1.A 19.22,46.83 v19.22,45.88
  Bottom 0.254: v21.15,42.72 19.22,44.65 v19.22,45.88
N$16
  Top 0.178: IC1.23 22.79,38.47 R19.2
N$17
  Top 0.178: IC1.22 23.3,39.05 R18.2
N$19
  Top 0.254: U11.5 30.58,39.05 30.09,39.55 29.3,39.55 28.62,40.22 28,40.22 27.37,39.6 27.37,37.44 28.26,36.55 29.77,36.55 30.68,37.36 32.34,37.36 33.81,38.93 33.81,41.41 33.78,41.41 33.56,41.63 32.84,41.63 31.69,42.76 J1.1 31.65,43.62 31.65,44.11 31.36,44.4 26.11,44.4 25.12,45.39 22.26,45.39 21.2,44.33 19.09,44.33 17.69,42.93 L5.1
N$23
  Top 0.178: U3.4 7.19,41.71
  Top 0.406: U3.4 7.39,41.73 C3.2
N$28
  Top 0.178: IC2.20 45.43,27.84 44.26,28.96 37.7,28.96 IC1.100
N$30
  Top 0.178: IC2.19 45.93,27.82 44.44,29.29 34.61,29.29 IC1.1
N$31
  Top 0.254: R21.2 28.76,39.42 U11.4 29.61,38.02 29.83,37.78 32.1,37.78 33.39,39.1 33.39,40.33 31.91,41.81 31.27,41.81 31.03,42.05 31.03,42.97 J1.2
N$32
  Top 0.178: IC2.18 46.43,27.83 44.65,29.62 33.67,29.64 33.29,29.21 IC1.2
N$33
  Top 0.178: IC2.17 46.93,27.87 44.82,29.97 33.49,29.97 32.79,29.25 IC1.3
N$34
  Top 0.254: R20.2 26.86,36.71 26.38,37.19 26.38,39.78 27.5,40.89 27.91,40.89 28.23,41.22 | 31.49,38.62 U11.6 31.45,39.03 30.29,40.18 29.27,40.18 28.23,41.22 | 28.23,41.22 28.62,41.22 29.44,42.03 30.06,42.03 30.23,42.2 30.23,42.82 J1.3
N$35
  Top 0.406: U2.P$2 6.34,6.68 R6.2
N$36
  Top 0.406: R6.1 C6.1
N$37
  Top 0.178: IC2.16 47.36,7.79 47.36,27.91 44.92,30.35 44.9,30.35 44.39,30.35 33.39,30.35 32.29,29.25 IC1.4
N$38
  Top 0.178: IC2.15 46.42,6.6 46.7,6.33 47.21,6.33 47.69,6.81 47.69,28.07 45.05,30.73 33.29,30.73 31.74,29.18 IC1.5
N$39
  Top 0.178: IC1.6 31.29,29.27 33.11,31.09 45.18,31.09 48.05,28.19 48.02,6.6 47.36,5.97 46.5,5.97 45.93,6.54 IC2.14
N$40
  Top 0.178: IC2.13 45.4,6.56 46.37,5.59 47.49,5.59 48.4,6.5 48.4,28.35 45.28,31.47 32.96,31.47 30.78,29.29 30.78,28.51 IC1.7
N$41
  Top 0.152: 39.36,6.05 38.97,5.66 38,5.66 37.24,6.42 37.24,7.78 37,8.02 37,8.99 36.87,9.12 35.08,9.12 34.69,8.74 31.06,8.74
  Top 0.178: IC1.61 26.79,10.77 | 30.09,9.7 31.06,8.74 | IC2.3 40.43,6.58 40.17,6.33 39.63,6.33 39.36,6.05
  Top 0.2: 26.79,10.77 27.85,9.71 30.08,9.71 | 30.08,9.71 30.09,9.71 | 30.09,9.7 30.08,9.71
N$42
  Top 0.152: 31.56,9.83 34.49,9.83 34.7,10.04 37.25,10.04 37.92,9.37 37.92,8.75 38.26,8.41 39.59,8.41
  Top 0.178: IC1.69 30.79,10.6 31.56,9.83 | 39.59,8.41 39.92,8.08 IC2.2
N$43  (via drill 0.5)
  Top 0.178: IC1.70 | IC2.31 39.93,27.73 39.62,28.04 38.27,28 v38.03,28.25 | v29.46,19.48 29.46,24.71 v29.53,24.79
  Top 0.254: IC1.70 31.28,14.3 v30.98,14.61
  Bottom 0.178: v29.53,24.79 29.53,25.45 32.39,28.31 v38.03,28.25
  Bottom 0.254: v29.46,19.48 29.46,16.13 v30.98,14.61
N$44
  Top 0.508: L4.1 52.53,6.17 U4.3
N$45
  Top 0.152: 39.02,6.39 38.71,6.08 38.02,6.08 37.55,6.55 37.55,7.63 37.55,7.65 37.55,7.91 37.31,8.14 37.31,9.12 36.99,9.43 34.95,9.43 34.64,9.12 31.23,9.12
  Top 0.178: IC1.64 28.29,12.06 31.23,9.12 | 39.43,7.18 IC2.1 39.43,6.79 39.09,6.45 39.02,6.39
  Top 0.2: 39.04,6.4 39.09,6.45
N$46
  Top 0.152: IC1.65 28.79,14.43 30.32,15.95 33.14,15.95 35.53,13.56 41.62,13.56 44.9,10.29 44.9,7.38 IC2.12
N$47  (via drill 0.5)
  Top 0.152: 31.41,9.47 34.56,9.47 34.83,9.73 37.12,9.73 37.61,9.24 37.61,8.27 37.85,8.03 37.85,7.83 v38.48,7.2
  Top 0.178: IC1.66 29.29,11.59 31.41,9.47 | v40.43,5.54 40.93,6.04 IC2.4 | 38.3,7.47 38.48,7.28 v38.48,7.2
  Bottom 0.178: v40.43,5.54 40.17,5.54 38.52,7.2 v38.48,7.2
N$48
  Top 0.152: IC2.11 44.43,10.22 41.42,13.23 35.37,13.23 32.99,15.62 30.5,15.62 29.79,14.91 IC1.67
N$49
  Top 0.152: IC1.68 30.28,14.88 30.71,15.31 32.81,15.29 35.17,12.93 41.29,12.93 42.44,11.79 IC2.7
N$50
  Top 0.178: IC1.9 29.84,31.5 30.29,31.85 45.46,31.85 48.79,28.5 48.76,6.38 47.64,5.26 46.17,5.26 45.05,6.4 44.21,6.4 43.93,6.69 IC2.10
N$52
  Top 0.178: IC2.9 43.43,6.7 44.09,6.04 44.82,6.04 45.94,4.93 47.84,4.93 49.14,6.22 49.14,28.83 45.74,32.18 29.96,32.21 29.33,31.57 29.33,28.53 IC1.10
N$53
  Top 0.254: R23.1 14.59,9.21 C35.1 14.93,9.7 15.83,10.6 16.32,10.6 17.65,11.94 17.65,13.36 19.09,14.8 IC1.50
N$54
  Top 0.178: IC2.8 42.94,7.34
  Top 0.254: 42.94,7.34 42.94,5.52
  Top 0.406: 42.94,5.52 C19.1 C7.1
  Top 0.508: C7.1 44.42,5.33 44.8,4.95 44.8,4.32 R17.2
N$55
  Top 0.254: IC1.47 18.77,16.3 16.09,13.61 14.28,13.61 13.86,13.2 R24.1 13.25,13.65 C36.1
N$56
  Top 0.508: R17.1 46.51,4.32 L4.2
N$57
  Top 0.254: R25.1 C37.1 15.96,7.78 16.33,8.16 17.49,8.16 21.35,12.02 22.01,12.04 22.24,12.27 22.29,12.39 IC1.52 | IC1.52 | IC1.52
N$59
  Top 0.254: C39.1 U1.1
N$62
  Top 0.254: T1.3 6.39,35.52 R2.2 R1.1
OPAMP1_OPAMP2_DATA
  Top 0.254: IC1.40 21.31,19.8 22.25,18.86 22.25,15.37 19.67,12.79 C34.A
PMOD_IO1  (via drill 0.5)
  Top 0.178: IC1.26 17.98,26.8 14.55,30.22 13.4,30.22
  Top 0.254: 13.4,30.22 13.41,30.21 v13.45,30.21
  Bottom 0.254: v13.45,30.21 13.45,31.48 10.17,34.77 10.17,40.07 14.45,44.35 SV2.6
PMOD_IO2  (via drill 0.5)
  Top 0.178: IC1.27 17.46,26.3 14.23,29.47 12.92,29.47 12.33,30.06 v12.33,30.22
  Bottom 0.254: v12.33,30.22 11.86,30.69 11.83,30.69 11.83,32.4 9.69,34.53 9.69,41.51 11.91,43.73 SV2.5
PMOD_IO3  (via drill 0.5)
  Top 0.152: v10.8,30.19 12.15,28.85 13.98,28.85 16.64,26.18 16.64,25.23 16.34,24.92 16.34,22.75 17.97,21.11 18.44,21.11 18.75,20.8 IC1.38
  Bottom 0.254: v10.8,30.19 10.8,30.54 10.81,32.76 9.2,34.35 9.2,45.84 SV2.4
PMOD_IO4  (via drill 0.5)
  Top 0.152: IC1.37 19.97,21.42 18.1,21.42 16.64,22.87 16.64,24.8 16.95,25.1 16.95,26.32 15.01,28.26 14.1,29.15 12.43,29.15 11.48,30.1 11.48,30.48 11.06,30.9 10.34,30.9 9.68,30.24 v9.68,30.2
  Bottom 0.254: v9.68,30.2 9.68,33.15 8.68,34.15 8.68,41.57 6.81,43.44 6.81,45.98 SV2.3
REF_CPU_OUT
  Top 0.203: 12.81,8.8 R25.2
  Top 0.254: 13.2,10.35 R23.2 R24.2 13.81,12.09 13.07,12.09 10.82,14.34 U1.6 11.06,15.27 C40.1 | 13.2,10.35 12.86,10.05 R25.2 | U1.5 10.62,13.39 11.18,12.83 11.18,12.37 13.2,10.35
SD_CD
  Top 0.254: JP1.Z4 JP1.Z3 47.26,32.86 42.98,32.86 42.84,33 R10.1
SD_CPU_MISO
  Top 0.152: IC1.13
  Top 0.2: IC1.13 27.89,28.59 27.89,31.11 29.68,32.9 30.25,32.9 36.88,32.89 38.31,32.89 45.13,39.71 47.47,39.71 48.26,38.91 52.27,38.91 53.65,40.29 JP1.7
  Top 0.254: IC1.13 27.86,28.57
SRAM_CPU_D0
  Top 0.178: IC1.92 42.93,22.75 45,24.84 45,26.9 IC2.21
SRAM_CPU_D1
  Top 0.178: IC1.93 42.95,23.3 44.62,24.97 44.62,25.96 44.44,26.14 44.44,27.04 IC2.22
SRAM_CPU_D2
  Top 0.178: IC1.94 42.94,23.8 44.14,24.99 44.19,25.68 43.93,25.93 IC2.23
SRAM_CPU_D3
  Top 0.178: IC1.95 41.36,24.3 42.94,25.88 42.94,27.04 IC2.25
SRAM_CPU_D4
  Top 0.178: IC1.96 41.3,24.8 42.44,25.93 IC2.26
SRAM_CPU_D5
  Top 0.178: IC1.97 41.19,25.3 41.93,26.04 IC2.27
SRAM_CPU_D6
  Top 0.178: IC1.98 41.09,25.71 41.43,26.14 IC2.28
SRAM_CPU_D7
  Top 0.178: IC2.29 40.96,27.02 40.96,26.47 40.8,26.11 37.8,26.11 37.71,26.24 35.55,26.24 IC1.99
SWCLK  (via drill 0.5)
  Top 0.178: IC1.76 36.55,14.8 36.97,14.38 43.25,14.38 44.59,13.03 v44.59,12.57
  Bottom 0.178: v44.59,12.57 47.73,9.44 SV1.3
SWDIO  (via drill 0.5)
  Top 0.178: IC1.77 36.71,15.3 37.13,14.88 v43.98,14.88
  Bottom 0.178: v43.98,14.88 46.89,11.98 SV1.2
SWI_CPU_RST  (via drill 0.5)
  Top 0.178: IC1.36 22.49,21.8 v23.56,20.73
  Bottom 0.178: SV1.5 46.12,4.36 44.65,5.83 44.65,5.87 44.59,5.87 39.74,10.72 35.45,10.72 33.16,8.43 30.6,8.43 24.7,14.33 24.7,19.59 v23.56,20.73
  Bottom 0.508: 23.59,20.7 v23.56,20.73
SWO  (via drill 0.5)
  Top 0.178: IC1.78 36.75,15.8 37.25,15.29 43.27,15.29 43.81,15.82 45.08,15.82 46.09,14.81 v46.09,9.45
  Bottom 0.178: SV1.4 48.64,6.9 v46.09,9.45
USB_ENABLE
  Top 0.152: 25.24,2.7 27.16,4.62 28.7,4.62 29.9,5.82 29.9,6.48 29.9,6.62 | 22.98,11.87 22.98,8.63
  Top 0.178: IC1.54 23.29,12.19 22.98,11.87
  Top 0.2: 25.24,2.7 24.08,2.7 23.76,3.02 23.76,7.85 22.98,8.63 | R9.1 29.9,8.15 29.9,6.62 SW1.2 30.22,6.93
  Top 0.254: C10.2 31.26,7.39 30.81,7.39 29.9,6.48
VAMP
  Top 0.406: U2.P$6 7.86,2.86 C1.A 12.36,2.5 13.56,1.31 19.16,1.31 20.93,3.08 20.93,4.16 U5.6
VBAT  (via drill 0.5)
  Top 0.178: R4.2 24.84,39.22 24.34,38.72 24.34,38.1 24.07,37.83 24.07,35.04 v24.33,34.78
  Top 0.254: v14.77,36.93 10.22,32.38 v5.65,32.38
  Top 0.508: U3.3 | U3.1 2.97,43.63 C2.1 | v2.12,36.73 2.58,37.18 U6.PWR@1
  Bottom 0.254: v5.65,32.38 4.94,33.09 3.84,33.09 2.12,34.8 v2.12,36.73 | v14.77,36.93 21.55,36.93 23.7,34.78 v24.33,34.78
  pour Top: 6.16,48.24 1.4,48.33 arc45 0.51,47.94 arc45 0.22,47.65 0.24,37.31 arc45 0.28,37.2 4.47,37.2 arc45 4.6,37.25 6.11,38.76 6.13,44.74 arc-45 6.13,44.88 6.09,44.95
VBUS  (via drill 0.5)
  Top 0.178: C14.1 37.34,16.3 IC1.79
  Top 0.254: IC1.79 34.72,16.3 33.72,17.3 31.92,17.3 v31.89,17.27 | IC1.72 32.29,14.24 v32.55,14.5 | T1.1 8.49,33.71 | 8.49,33.71 9.46,33.71 16.12,40.37 L5.2 | R1.2 8.49,33.71
  Top 0.508: 31.92,17.3 31.62,16.99 26.69,16.99 25.29,18.39 25.29,20.98 22.75,23.52 22.75,24.77 22.78,24.79 v22.75,25.48 | L5.2 17.69,31.11 v18.62,30.19
  Bottom 0.508: v31.89,17.27 31.89,17.25 32.58,16.56 32.58,14.53 v32.55,14.5 | v22.75,25.48 18.62,29.61 v18.62,30.19
VDD  (via drill 0.5)
  Top 0.2: U5.1 25.61,6.31 R3.1
  Top 0.254: IC1.45 20.07,17.27 18.11,17.27 17.89,17.02 17.11,17.02 16.91,16.86 16.91,16.81 C13.1 | IC1.41 17.23,19.3 C15.1 | U5.1 24.92,4.09 v24.94,4.08 | U1.4 10.13,11.78 C38.1
  Top 0.5: C15.1 16.8,19.73 16.58,19.73 15.69,20.61 15.69,23.51 14.84,24.36 v14.84,24.56
  Top 0.508: C15.1 17.07,19.41 | 15.3,16.58 11.53,16.58 11.53,16.63 10.2,17.96 | 10.2,17.96 7.51,20.65 | 7.51,20.65 5.91,22.25 5.91,26.77 v6.16,27.03 6.2,27.06 R16.1 | C12.1 15.3,16.58 | 15.3,16.58 C13.1 | 10.2,17.96 10.15,17.96 8.93,16.73 8.93,12.9 9.39,12.44 U1.4 | v21.96,3.68 21.96,1.83 20.79,0.66 1.44,0.66 0.57,1.53 0.57,13.71 7.51,20.65
  Bottom 0.5: 13.98,28.39 14.84,27.53 v14.84,24.56
  Bottom 0.508: v6.16,27.03 8.56,27.03 9.92,28.39 13.98,28.39 | v24.94,4.08 22.36,4.08 v21.96,3.68
VMIC_EN_N
  Top 0.178: 26.36,13.03 IC1.60
  Top 0.2: IC1.60 26.29,11.48 26.36,11.41 26.36,8.26 25.94,7.84 R3.2 25.49,7.19 25.48,7.19 25.34,7.04 25.25,6.96 U5.2
VREF_EN  (via drill 0.5)
  Top 0.178: 20.11,24.82 IC1.30 19.3,24.79 19.17,24.92 17.21,24.92 16.96,24.66 16.96,23.52 v17.39,23.09 | U1.3 7.71,12.42 v6.51,12.42
  Bottom 0.178: v6.51,12.42 6.51,13.24 16.36,23.09 v17.39,23.09
VREGO  (via drill 0.5)
  Top 0.254: IC1.73 32.79,11.67 31.87,11.81 C16.1
  Top 0.406: 32.63,11.61 33.6,10.72
  Top 0.508: 31.87,11.81 32.63,11.61 | 33.6,10.72 35.91,10.77 37.3,10.77 v38.9,9.17 | v1.24,24.04 0.67,24.61 0.67,27.2 0.76,27.29 0.76,33.66 1.76,34.66 T1.5
  Bottom 0.508: v1.24,24.04 1.23,24.04 1.24,2.63 1.24,2.4 arc90 2.29,1.35 3.73,1.35 21.4,1.32 22.32,1.32 arc90 23.09,2.1 23.09,2.4 arc-90 23.89,3.2 25.29,3.2 arc90 25.79,3.5 arc-90 26.24,4.15 33.88,4.15 v38.9,9.17
(copper drawn outside any net)
  shapes: Bottom area x2

### Text on the board
bPlace: tx | rx | 1.1.0 | PROG | DEFAULT | USB/OFF | CUSTOM